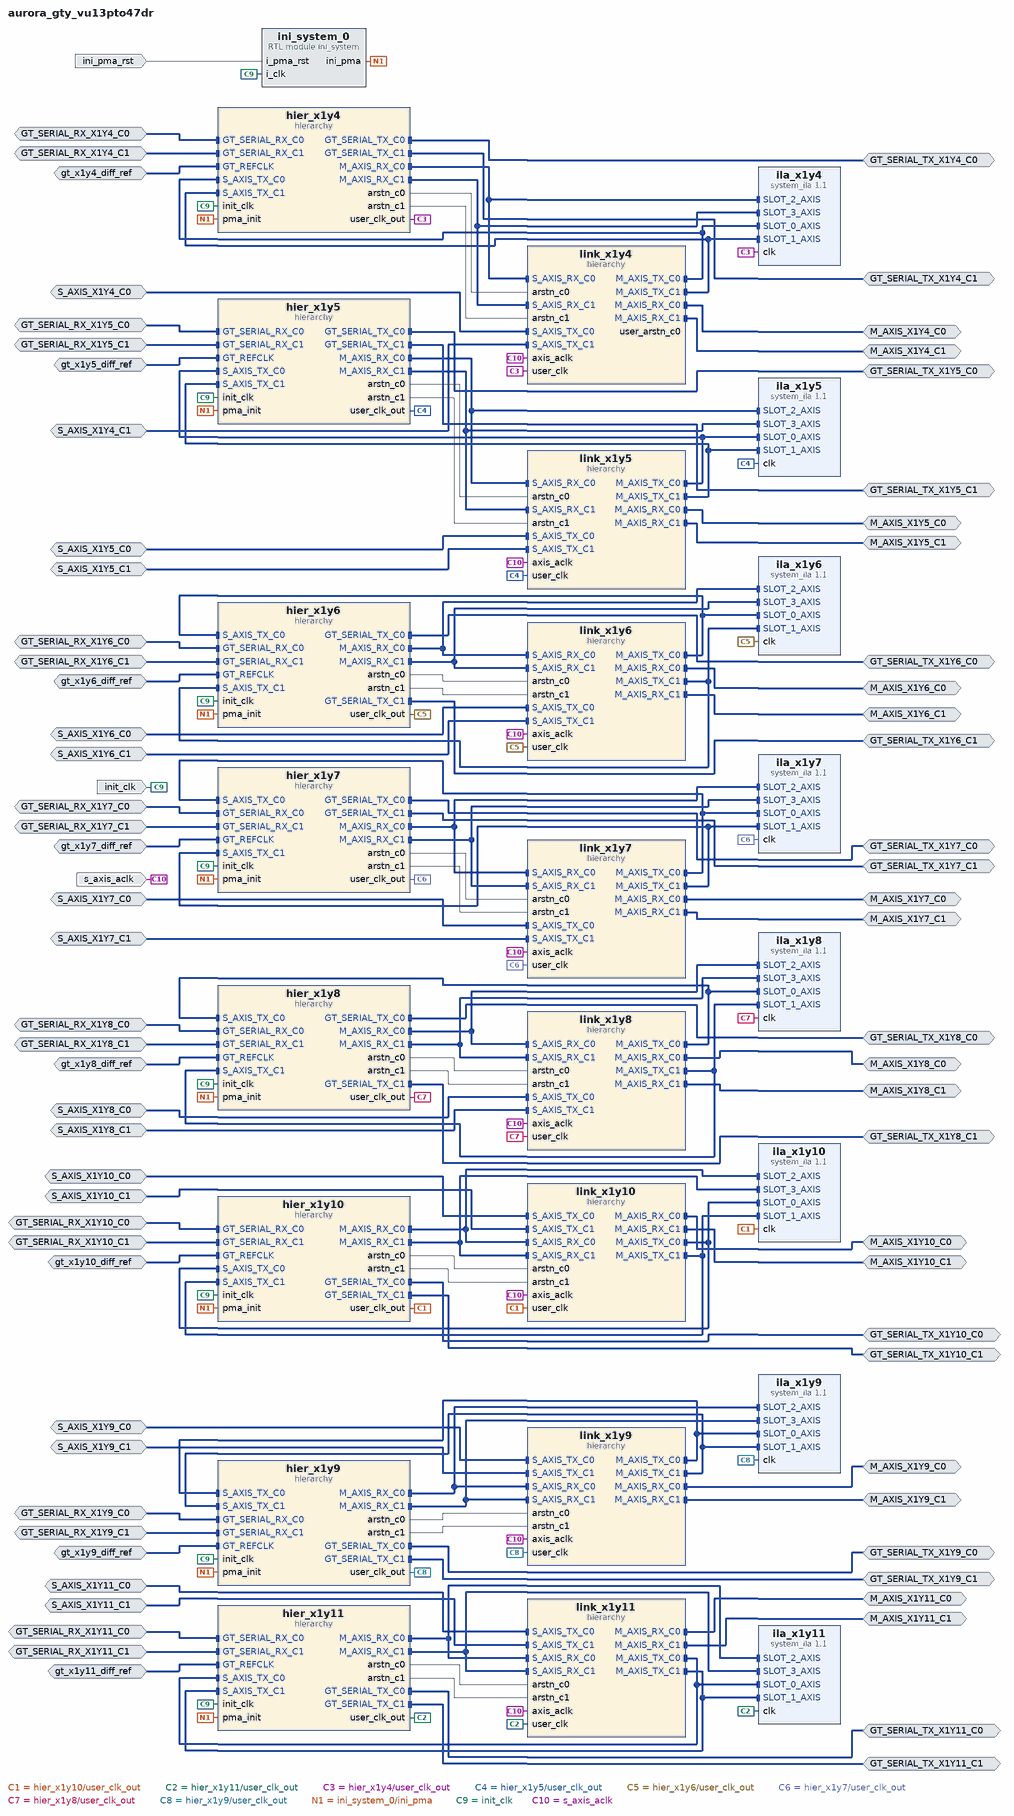
[diagram p0: block diagram of the top level]
# Vivado block design aurora_gty_vu13pto47dr, xcvu13p-fhgb2104-2-i, Vivado 2025.2
create_bd_design aurora_gty_vu13pto47dr

create_bd_intf_port -mode Slave -vlnv xilinx.com:display_aurora64b66b:GT_Serial_Transceiver_Pins_RX_rtl:1.0 GT_SERIAL_RX_X1Y8_C0
create_bd_intf_port -mode Slave -vlnv xilinx.com:display_aurora64b66b:GT_Serial_Transceiver_Pins_RX_rtl:1.0 GT_SERIAL_RX_X1Y4_C0
create_bd_intf_port -mode Slave -vlnv xilinx.com:display_aurora64b66b:GT_Serial_Transceiver_Pins_RX_rtl:1.0 GT_SERIAL_RX_X1Y4_C1
create_bd_intf_port -mode Master -vlnv xilinx.com:display_aurora64b66b:GT_Serial_Transceiver_Pins_TX_rtl:1.0 GT_SERIAL_TX_X1Y8_C0
create_bd_intf_port -mode Master -vlnv xilinx.com:display_aurora64b66b:GT_Serial_Transceiver_Pins_TX_rtl:1.0 GT_SERIAL_TX_X1Y4_C0
create_bd_intf_port -mode Master -vlnv xilinx.com:display_aurora64b66b:GT_Serial_Transceiver_Pins_TX_rtl:1.0 GT_SERIAL_TX_X1Y4_C1
create_bd_intf_port -mode Master -vlnv xilinx.com:interface:axis_rtl:1.0 M_AXIS_X1Y4_C0
set_property -dict {CONFIG.FREQ_HZ 256000000} [get_bd_intf_ports M_AXIS_X1Y4_C0]
create_bd_intf_port -mode Master -vlnv xilinx.com:interface:axis_rtl:1.0 M_AXIS_X1Y4_C1
set_property -dict {CONFIG.FREQ_HZ 256000000} [get_bd_intf_ports M_AXIS_X1Y4_C1]
create_bd_intf_port -mode Master -vlnv xilinx.com:interface:axis_rtl:1.0 M_AXIS_X1Y8_C0
set_property -dict {CONFIG.FREQ_HZ 256000000} [get_bd_intf_ports M_AXIS_X1Y8_C0]
create_bd_intf_port -mode Slave -vlnv xilinx.com:interface:axis_rtl:1.0 S_AXIS_X1Y4_C0
set_property -dict [list \
  CONFIG.FREQ_HZ 256000000 \
  CONFIG.HAS_TKEEP 0 \
  CONFIG.HAS_TLAST 1 \
  CONFIG.HAS_TREADY 1 \
  CONFIG.HAS_TSTRB 0 \
  CONFIG.LAYERED_METADATA undef \
  CONFIG.TDATA_NUM_BYTES 16 \
  CONFIG.TDEST_WIDTH 0 \
  CONFIG.TID_WIDTH 0 \
  CONFIG.TUSER_WIDTH 64 \
] [get_bd_intf_ports S_AXIS_X1Y4_C0]
create_bd_intf_port -mode Slave -vlnv xilinx.com:interface:axis_rtl:1.0 S_AXIS_X1Y4_C1
set_property -dict [list \
  CONFIG.FREQ_HZ 256000000 \
  CONFIG.HAS_TKEEP 0 \
  CONFIG.HAS_TLAST 1 \
  CONFIG.HAS_TREADY 1 \
  CONFIG.HAS_TSTRB 0 \
  CONFIG.LAYERED_METADATA undef \
  CONFIG.TDATA_NUM_BYTES 16 \
  CONFIG.TDEST_WIDTH 0 \
  CONFIG.TID_WIDTH 0 \
  CONFIG.TUSER_WIDTH 64 \
] [get_bd_intf_ports S_AXIS_X1Y4_C1]
create_bd_intf_port -mode Slave -vlnv xilinx.com:interface:diff_clock_rtl:1.0 gt_x1y4_diff_ref
set_property -dict {CONFIG.FREQ_HZ 156250000} [get_bd_intf_ports gt_x1y4_diff_ref]
create_bd_intf_port -mode Slave -vlnv xilinx.com:interface:diff_clock_rtl:1.0 gt_x1y8_diff_ref
set_property -dict {CONFIG.FREQ_HZ 156250000} [get_bd_intf_ports gt_x1y8_diff_ref]
create_bd_intf_port -mode Slave -vlnv xilinx.com:interface:diff_clock_rtl:1.0 gt_x1y5_diff_ref
set_property -dict {CONFIG.FREQ_HZ 156250000} [get_bd_intf_ports gt_x1y5_diff_ref]
create_bd_intf_port -mode Slave -vlnv xilinx.com:display_aurora64b66b:GT_Serial_Transceiver_Pins_RX_rtl:1.0 GT_SERIAL_RX_X1Y5_C0
create_bd_intf_port -mode Slave -vlnv xilinx.com:display_aurora64b66b:GT_Serial_Transceiver_Pins_RX_rtl:1.0 GT_SERIAL_RX_X1Y5_C1
create_bd_intf_port -mode Master -vlnv xilinx.com:display_aurora64b66b:GT_Serial_Transceiver_Pins_TX_rtl:1.0 GT_SERIAL_TX_X1Y5_C0
create_bd_intf_port -mode Master -vlnv xilinx.com:display_aurora64b66b:GT_Serial_Transceiver_Pins_TX_rtl:1.0 GT_SERIAL_TX_X1Y5_C1
create_bd_intf_port -mode Slave -vlnv xilinx.com:interface:axis_rtl:1.0 S_AXIS_X1Y5_C0
set_property -dict [list \
  CONFIG.FREQ_HZ 256000000 \
  CONFIG.HAS_TKEEP 0 \
  CONFIG.HAS_TLAST 1 \
  CONFIG.HAS_TREADY 1 \
  CONFIG.HAS_TSTRB 0 \
  CONFIG.LAYERED_METADATA undef \
  CONFIG.TDATA_NUM_BYTES 16 \
  CONFIG.TDEST_WIDTH 0 \
  CONFIG.TID_WIDTH 0 \
  CONFIG.TUSER_WIDTH 64 \
] [get_bd_intf_ports S_AXIS_X1Y5_C0]
create_bd_intf_port -mode Slave -vlnv xilinx.com:interface:axis_rtl:1.0 S_AXIS_X1Y5_C1
set_property -dict [list \
  CONFIG.FREQ_HZ 256000000 \
  CONFIG.HAS_TKEEP 0 \
  CONFIG.HAS_TLAST 1 \
  CONFIG.HAS_TREADY 1 \
  CONFIG.HAS_TSTRB 0 \
  CONFIG.LAYERED_METADATA undef \
  CONFIG.TDATA_NUM_BYTES 16 \
  CONFIG.TDEST_WIDTH 0 \
  CONFIG.TID_WIDTH 0 \
  CONFIG.TUSER_WIDTH 64 \
] [get_bd_intf_ports S_AXIS_X1Y5_C1]
create_bd_intf_port -mode Slave -vlnv xilinx.com:interface:diff_clock_rtl:1.0 gt_x1y6_diff_ref
set_property -dict {CONFIG.FREQ_HZ 156250000} [get_bd_intf_ports gt_x1y6_diff_ref]
create_bd_intf_port -mode Slave -vlnv xilinx.com:display_aurora64b66b:GT_Serial_Transceiver_Pins_RX_rtl:1.0 GT_SERIAL_RX_X1Y6_C0
create_bd_intf_port -mode Slave -vlnv xilinx.com:display_aurora64b66b:GT_Serial_Transceiver_Pins_RX_rtl:1.0 GT_SERIAL_RX_X1Y6_C1
create_bd_intf_port -mode Master -vlnv xilinx.com:display_aurora64b66b:GT_Serial_Transceiver_Pins_TX_rtl:1.0 GT_SERIAL_TX_X1Y6_C0
create_bd_intf_port -mode Master -vlnv xilinx.com:display_aurora64b66b:GT_Serial_Transceiver_Pins_TX_rtl:1.0 GT_SERIAL_TX_X1Y6_C1
create_bd_intf_port -mode Slave -vlnv xilinx.com:interface:axis_rtl:1.0 S_AXIS_X1Y6_C0
set_property -dict [list \
  CONFIG.FREQ_HZ 256000000 \
  CONFIG.HAS_TKEEP 0 \
  CONFIG.HAS_TLAST 1 \
  CONFIG.HAS_TREADY 1 \
  CONFIG.HAS_TSTRB 0 \
  CONFIG.LAYERED_METADATA undef \
  CONFIG.TDATA_NUM_BYTES 16 \
  CONFIG.TDEST_WIDTH 0 \
  CONFIG.TID_WIDTH 0 \
  CONFIG.TUSER_WIDTH 64 \
] [get_bd_intf_ports S_AXIS_X1Y6_C0]
create_bd_intf_port -mode Slave -vlnv xilinx.com:interface:axis_rtl:1.0 S_AXIS_X1Y6_C1
set_property -dict [list \
  CONFIG.FREQ_HZ 256000000 \
  CONFIG.HAS_TKEEP 0 \
  CONFIG.HAS_TLAST 1 \
  CONFIG.HAS_TREADY 1 \
  CONFIG.HAS_TSTRB 0 \
  CONFIG.LAYERED_METADATA undef \
  CONFIG.TDATA_NUM_BYTES 16 \
  CONFIG.TDEST_WIDTH 0 \
  CONFIG.TID_WIDTH 0 \
  CONFIG.TUSER_WIDTH 64 \
] [get_bd_intf_ports S_AXIS_X1Y6_C1]
create_bd_intf_port -mode Slave -vlnv xilinx.com:interface:diff_clock_rtl:1.0 gt_x1y7_diff_ref
set_property -dict {CONFIG.FREQ_HZ 156250000} [get_bd_intf_ports gt_x1y7_diff_ref]
create_bd_intf_port -mode Slave -vlnv xilinx.com:display_aurora64b66b:GT_Serial_Transceiver_Pins_RX_rtl:1.0 GT_SERIAL_RX_X1Y7_C0
create_bd_intf_port -mode Slave -vlnv xilinx.com:display_aurora64b66b:GT_Serial_Transceiver_Pins_RX_rtl:1.0 GT_SERIAL_RX_X1Y7_C1
create_bd_intf_port -mode Master -vlnv xilinx.com:display_aurora64b66b:GT_Serial_Transceiver_Pins_TX_rtl:1.0 GT_SERIAL_TX_X1Y7_C0
create_bd_intf_port -mode Master -vlnv xilinx.com:display_aurora64b66b:GT_Serial_Transceiver_Pins_TX_rtl:1.0 GT_SERIAL_TX_X1Y7_C1
create_bd_intf_port -mode Slave -vlnv xilinx.com:interface:axis_rtl:1.0 S_AXIS_X1Y7_C0
set_property -dict [list \
  CONFIG.FREQ_HZ 256000000 \
  CONFIG.HAS_TKEEP 0 \
  CONFIG.HAS_TLAST 1 \
  CONFIG.HAS_TREADY 1 \
  CONFIG.HAS_TSTRB 0 \
  CONFIG.LAYERED_METADATA undef \
  CONFIG.TDATA_NUM_BYTES 16 \
  CONFIG.TDEST_WIDTH 0 \
  CONFIG.TID_WIDTH 0 \
  CONFIG.TUSER_WIDTH 64 \
] [get_bd_intf_ports S_AXIS_X1Y7_C0]
create_bd_intf_port -mode Slave -vlnv xilinx.com:interface:axis_rtl:1.0 S_AXIS_X1Y7_C1
set_property -dict [list \
  CONFIG.FREQ_HZ 256000000 \
  CONFIG.HAS_TKEEP 0 \
  CONFIG.HAS_TLAST 1 \
  CONFIG.HAS_TREADY 1 \
  CONFIG.HAS_TSTRB 0 \
  CONFIG.LAYERED_METADATA undef \
  CONFIG.TDATA_NUM_BYTES 16 \
  CONFIG.TDEST_WIDTH 0 \
  CONFIG.TID_WIDTH 0 \
  CONFIG.TUSER_WIDTH 64 \
] [get_bd_intf_ports S_AXIS_X1Y7_C1]
create_bd_intf_port -mode Slave -vlnv xilinx.com:display_aurora64b66b:GT_Serial_Transceiver_Pins_RX_rtl:1.0 GT_SERIAL_RX_X1Y8_C1
create_bd_intf_port -mode Master -vlnv xilinx.com:display_aurora64b66b:GT_Serial_Transceiver_Pins_TX_rtl:1.0 GT_SERIAL_TX_X1Y8_C1
create_bd_intf_port -mode Slave -vlnv xilinx.com:interface:diff_clock_rtl:1.0 gt_x1y9_diff_ref
set_property -dict {CONFIG.FREQ_HZ 156250000} [get_bd_intf_ports gt_x1y9_diff_ref]
create_bd_intf_port -mode Slave -vlnv xilinx.com:display_aurora64b66b:GT_Serial_Transceiver_Pins_RX_rtl:1.0 GT_SERIAL_RX_X1Y9_C0
create_bd_intf_port -mode Slave -vlnv xilinx.com:display_aurora64b66b:GT_Serial_Transceiver_Pins_RX_rtl:1.0 GT_SERIAL_RX_X1Y9_C1
create_bd_intf_port -mode Master -vlnv xilinx.com:display_aurora64b66b:GT_Serial_Transceiver_Pins_TX_rtl:1.0 GT_SERIAL_TX_X1Y9_C0
create_bd_intf_port -mode Master -vlnv xilinx.com:display_aurora64b66b:GT_Serial_Transceiver_Pins_TX_rtl:1.0 GT_SERIAL_TX_X1Y9_C1
create_bd_intf_port -mode Slave -vlnv xilinx.com:interface:diff_clock_rtl:1.0 gt_x1y10_diff_ref
set_property -dict {CONFIG.FREQ_HZ 156250000} [get_bd_intf_ports gt_x1y10_diff_ref]
create_bd_intf_port -mode Slave -vlnv xilinx.com:display_aurora64b66b:GT_Serial_Transceiver_Pins_RX_rtl:1.0 GT_SERIAL_RX_X1Y10_C0
create_bd_intf_port -mode Slave -vlnv xilinx.com:display_aurora64b66b:GT_Serial_Transceiver_Pins_RX_rtl:1.0 GT_SERIAL_RX_X1Y10_C1
create_bd_intf_port -mode Master -vlnv xilinx.com:display_aurora64b66b:GT_Serial_Transceiver_Pins_TX_rtl:1.0 GT_SERIAL_TX_X1Y10_C0
create_bd_intf_port -mode Master -vlnv xilinx.com:display_aurora64b66b:GT_Serial_Transceiver_Pins_TX_rtl:1.0 GT_SERIAL_TX_X1Y10_C1
create_bd_intf_port -mode Slave -vlnv xilinx.com:interface:diff_clock_rtl:1.0 gt_x1y11_diff_ref
set_property -dict {CONFIG.FREQ_HZ 156250000} [get_bd_intf_ports gt_x1y11_diff_ref]
create_bd_intf_port -mode Slave -vlnv xilinx.com:display_aurora64b66b:GT_Serial_Transceiver_Pins_RX_rtl:1.0 GT_SERIAL_RX_X1Y11_C0
create_bd_intf_port -mode Slave -vlnv xilinx.com:display_aurora64b66b:GT_Serial_Transceiver_Pins_RX_rtl:1.0 GT_SERIAL_RX_X1Y11_C1
create_bd_intf_port -mode Master -vlnv xilinx.com:display_aurora64b66b:GT_Serial_Transceiver_Pins_TX_rtl:1.0 GT_SERIAL_TX_X1Y11_C0
create_bd_intf_port -mode Master -vlnv xilinx.com:display_aurora64b66b:GT_Serial_Transceiver_Pins_TX_rtl:1.0 GT_SERIAL_TX_X1Y11_C1
create_bd_intf_port -mode Master -vlnv xilinx.com:interface:axis_rtl:1.0 M_AXIS_X1Y5_C0
set_property -dict {CONFIG.FREQ_HZ 256000000} [get_bd_intf_ports M_AXIS_X1Y5_C0]
create_bd_intf_port -mode Master -vlnv xilinx.com:interface:axis_rtl:1.0 M_AXIS_X1Y5_C1
set_property -dict {CONFIG.FREQ_HZ 256000000} [get_bd_intf_ports M_AXIS_X1Y5_C1]
create_bd_intf_port -mode Master -vlnv xilinx.com:interface:axis_rtl:1.0 M_AXIS_X1Y6_C0
set_property -dict {CONFIG.FREQ_HZ 256000000} [get_bd_intf_ports M_AXIS_X1Y6_C0]
create_bd_intf_port -mode Master -vlnv xilinx.com:interface:axis_rtl:1.0 M_AXIS_X1Y6_C1
set_property -dict {CONFIG.FREQ_HZ 256000000} [get_bd_intf_ports M_AXIS_X1Y6_C1]
create_bd_intf_port -mode Master -vlnv xilinx.com:interface:axis_rtl:1.0 M_AXIS_X1Y7_C0
set_property -dict {CONFIG.FREQ_HZ 256000000} [get_bd_intf_ports M_AXIS_X1Y7_C0]
create_bd_intf_port -mode Master -vlnv xilinx.com:interface:axis_rtl:1.0 M_AXIS_X1Y7_C1
set_property -dict {CONFIG.FREQ_HZ 256000000} [get_bd_intf_ports M_AXIS_X1Y7_C1]
create_bd_intf_port -mode Master -vlnv xilinx.com:interface:axis_rtl:1.0 M_AXIS_X1Y8_C1
set_property -dict {CONFIG.FREQ_HZ 256000000} [get_bd_intf_ports M_AXIS_X1Y8_C1]
create_bd_intf_port -mode Slave -vlnv xilinx.com:interface:axis_rtl:1.0 S_AXIS_X1Y8_C0
set_property -dict [list \
  CONFIG.FREQ_HZ 256000000 \
  CONFIG.HAS_TKEEP 0 \
  CONFIG.HAS_TLAST 1 \
  CONFIG.HAS_TREADY 1 \
  CONFIG.HAS_TSTRB 0 \
  CONFIG.LAYERED_METADATA undef \
  CONFIG.TDATA_NUM_BYTES 16 \
  CONFIG.TDEST_WIDTH 0 \
  CONFIG.TID_WIDTH 0 \
  CONFIG.TUSER_WIDTH 64 \
] [get_bd_intf_ports S_AXIS_X1Y8_C0]
create_bd_intf_port -mode Slave -vlnv xilinx.com:interface:axis_rtl:1.0 S_AXIS_X1Y8_C1
set_property -dict [list \
  CONFIG.FREQ_HZ 256000000 \
  CONFIG.HAS_TKEEP 0 \
  CONFIG.HAS_TLAST 1 \
  CONFIG.HAS_TREADY 1 \
  CONFIG.HAS_TSTRB 0 \
  CONFIG.LAYERED_METADATA undef \
  CONFIG.TDATA_NUM_BYTES 16 \
  CONFIG.TDEST_WIDTH 0 \
  CONFIG.TID_WIDTH 0 \
  CONFIG.TUSER_WIDTH 64 \
] [get_bd_intf_ports S_AXIS_X1Y8_C1]
create_bd_intf_port -mode Master -vlnv xilinx.com:interface:axis_rtl:1.0 M_AXIS_X1Y9_C0
set_property -dict {CONFIG.FREQ_HZ 256000000} [get_bd_intf_ports M_AXIS_X1Y9_C0]
create_bd_intf_port -mode Master -vlnv xilinx.com:interface:axis_rtl:1.0 M_AXIS_X1Y9_C1
set_property -dict {CONFIG.FREQ_HZ 256000000} [get_bd_intf_ports M_AXIS_X1Y9_C1]
create_bd_intf_port -mode Slave -vlnv xilinx.com:interface:axis_rtl:1.0 S_AXIS_X1Y9_C0
set_property -dict [list \
  CONFIG.FREQ_HZ 256000000 \
  CONFIG.HAS_TKEEP 0 \
  CONFIG.HAS_TLAST 1 \
  CONFIG.HAS_TREADY 1 \
  CONFIG.HAS_TSTRB 0 \
  CONFIG.LAYERED_METADATA undef \
  CONFIG.TDATA_NUM_BYTES 16 \
  CONFIG.TDEST_WIDTH 0 \
  CONFIG.TID_WIDTH 0 \
  CONFIG.TUSER_WIDTH 64 \
] [get_bd_intf_ports S_AXIS_X1Y9_C0]
create_bd_intf_port -mode Slave -vlnv xilinx.com:interface:axis_rtl:1.0 S_AXIS_X1Y9_C1
set_property -dict [list \
  CONFIG.FREQ_HZ 256000000 \
  CONFIG.HAS_TKEEP 0 \
  CONFIG.HAS_TLAST 1 \
  CONFIG.HAS_TREADY 1 \
  CONFIG.HAS_TSTRB 0 \
  CONFIG.LAYERED_METADATA undef \
  CONFIG.TDATA_NUM_BYTES 16 \
  CONFIG.TDEST_WIDTH 0 \
  CONFIG.TID_WIDTH 0 \
  CONFIG.TUSER_WIDTH 64 \
] [get_bd_intf_ports S_AXIS_X1Y9_C1]
create_bd_intf_port -mode Master -vlnv xilinx.com:interface:axis_rtl:1.0 M_AXIS_X1Y10_C0
set_property -dict {CONFIG.FREQ_HZ 256000000} [get_bd_intf_ports M_AXIS_X1Y10_C0]
create_bd_intf_port -mode Master -vlnv xilinx.com:interface:axis_rtl:1.0 M_AXIS_X1Y10_C1
set_property -dict {CONFIG.FREQ_HZ 256000000} [get_bd_intf_ports M_AXIS_X1Y10_C1]
create_bd_intf_port -mode Slave -vlnv xilinx.com:interface:axis_rtl:1.0 S_AXIS_X1Y10_C0
set_property -dict [list \
  CONFIG.FREQ_HZ 256000000 \
  CONFIG.HAS_TKEEP 0 \
  CONFIG.HAS_TLAST 1 \
  CONFIG.HAS_TREADY 1 \
  CONFIG.HAS_TSTRB 0 \
  CONFIG.LAYERED_METADATA undef \
  CONFIG.TDATA_NUM_BYTES 16 \
  CONFIG.TDEST_WIDTH 0 \
  CONFIG.TID_WIDTH 0 \
  CONFIG.TUSER_WIDTH 64 \
] [get_bd_intf_ports S_AXIS_X1Y10_C0]
create_bd_intf_port -mode Slave -vlnv xilinx.com:interface:axis_rtl:1.0 S_AXIS_X1Y10_C1
set_property -dict [list \
  CONFIG.FREQ_HZ 256000000 \
  CONFIG.HAS_TKEEP 0 \
  CONFIG.HAS_TLAST 1 \
  CONFIG.HAS_TREADY 1 \
  CONFIG.HAS_TSTRB 0 \
  CONFIG.LAYERED_METADATA undef \
  CONFIG.TDATA_NUM_BYTES 16 \
  CONFIG.TDEST_WIDTH 0 \
  CONFIG.TID_WIDTH 0 \
  CONFIG.TUSER_WIDTH 64 \
] [get_bd_intf_ports S_AXIS_X1Y10_C1]
create_bd_intf_port -mode Master -vlnv xilinx.com:interface:axis_rtl:1.0 M_AXIS_X1Y11_C0
set_property -dict {CONFIG.FREQ_HZ 256000000} [get_bd_intf_ports M_AXIS_X1Y11_C0]
create_bd_intf_port -mode Master -vlnv xilinx.com:interface:axis_rtl:1.0 M_AXIS_X1Y11_C1
set_property -dict {CONFIG.FREQ_HZ 256000000} [get_bd_intf_ports M_AXIS_X1Y11_C1]
create_bd_intf_port -mode Slave -vlnv xilinx.com:interface:axis_rtl:1.0 S_AXIS_X1Y11_C0
set_property -dict [list \
  CONFIG.FREQ_HZ 256000000 \
  CONFIG.HAS_TKEEP 0 \
  CONFIG.HAS_TLAST 1 \
  CONFIG.HAS_TREADY 1 \
  CONFIG.HAS_TSTRB 0 \
  CONFIG.LAYERED_METADATA undef \
  CONFIG.TDATA_NUM_BYTES 16 \
  CONFIG.TDEST_WIDTH 0 \
  CONFIG.TID_WIDTH 0 \
  CONFIG.TUSER_WIDTH 64 \
] [get_bd_intf_ports S_AXIS_X1Y11_C0]
create_bd_intf_port -mode Slave -vlnv xilinx.com:interface:axis_rtl:1.0 S_AXIS_X1Y11_C1
set_property -dict [list \
  CONFIG.FREQ_HZ 256000000 \
  CONFIG.HAS_TKEEP 0 \
  CONFIG.HAS_TLAST 1 \
  CONFIG.HAS_TREADY 1 \
  CONFIG.HAS_TSTRB 0 \
  CONFIG.LAYERED_METADATA undef \
  CONFIG.TDATA_NUM_BYTES 16 \
  CONFIG.TDEST_WIDTH 0 \
  CONFIG.TID_WIDTH 0 \
  CONFIG.TUSER_WIDTH 64 \
] [get_bd_intf_ports S_AXIS_X1Y11_C1]
create_bd_port -dir I -type rst ini_pma_rst
set_property -dict {CONFIG.POLARITY ACTIVE_HIGH} [get_bd_ports ini_pma_rst]
create_bd_port -dir I -type clk init_clk
set_property -dict {CONFIG.ASSOCIATED_RESET ini_pma_rst CONFIG.FREQ_HZ 100000000} [get_bd_ports init_clk]
create_bd_port -dir I -type clk s_axis_aclk
set_property -dict [list \
  CONFIG.ASSOCIATED_BUSIF M_AXIS_X1Y4_C0:M_AXIS_X1Y4_C0_1:M_AXIS_X1Y8_C0:S_AXIS_X1Y4_C0:S_AXIS_X1Y4_C0_1:S_AXIS_X1Y5_C0:S_AXIS_X1Y5_C0_1:S_AXIS_X1Y6_C0:S_AXIS_X1Y6_C0_1:S_AXIS_X1Y7_C0:S_AXIS_X1Y7_C0_1:M_AXIS_X1Y5_C0:M_AXIS_X1Y5_C0_1:M_AXIS_X1Y6_C0:M_AXIS_X1Y6_C0_1:M_AXIS_X1Y7_C0:M_AXIS_X1Y7_C0_1:M_AXIS_X1Y8_C0_1:S_AXIS_X1Y8_C0:S_AXIS_X1Y8_C0_1:M_AXIS_X1Y9_C0:M_AXIS_X1Y9_C0_1:S_AXIS_X1Y9_C0:S_AXIS_X1Y9_C0_1:M_AXIS_X1Y10_C0:M_AXIS_X1Y10_C0_1:S_AXIS_X1Y10_C0:S_AXIS_X1Y10_C0_1:M_AXIS_X1Y11_C0:M_AXIS_X1Y11_C0_1:S_AXIS_X1Y11_C0:S_AXIS_X1Y11_C0_1:M_AXIS_X1Y4_C1:S_AXIS_X1Y4_C1:S_AXIS_X1Y5_C1:S_AXIS_X1Y6_C1:S_AXIS_X1Y7_C1:M_AXIS_X1Y5_C1:M_AXIS_X1Y6_C1:M_AXIS_X1Y7_C1:M_AXIS_X1Y8_C1:S_AXIS_X1Y8_C1:M_AXIS_X1Y9_C1:S_AXIS_X1Y9_C1:M_AXIS_X1Y10_C1:S_AXIS_X1Y10_C1:M_AXIS_X1Y11_C1:S_AXIS_X1Y11_C1 \
  CONFIG.FREQ_HZ 256000000 \
] [get_bd_ports s_axis_aclk]

create_bd_cell -type module -reference ini_system ini_system_0
create_bd_cell -type hier hier_x1y4
create_bd_cell -type hier hier_x1y8
create_bd_cell -type hier hier_x1y9
create_bd_cell -type hier hier_x1y10
create_bd_cell -type hier hier_x1y11
create_bd_cell -type hier hier_x1y5
create_bd_cell -type hier hier_x1y6
create_bd_cell -type hier hier_x1y7
create_bd_cell -type hier link_x1y4
create_bd_cell -type hier link_x1y5
create_bd_cell -type hier link_x1y6
create_bd_cell -type hier link_x1y7
create_bd_cell -type hier link_x1y8
create_bd_cell -type hier link_x1y9
create_bd_cell -type hier link_x1y10
create_bd_cell -type hier link_x1y11
create_bd_cell -type ip -vlnv xilinx.com:ip:system_ila:1.1 ila_x1y4
set_property -dict [list \
  CONFIG.C_DATA_DEPTH 2048 \
  CONFIG.C_MON_TYPE INTERFACE \
  CONFIG.C_NUM_MONITOR_SLOTS 4 \
  CONFIG.C_SLOT_0_INTF_TYPE xilinx.com:interface:axis_rtl:1.0 \
  CONFIG.C_SLOT_1_INTF_TYPE xilinx.com:interface:axis_rtl:1.0 \
  CONFIG.C_SLOT_2_INTF_TYPE xilinx.com:interface:axis_rtl:1.0 \
  CONFIG.C_SLOT_3_INTF_TYPE xilinx.com:interface:axis_rtl:1.0 \
] [get_bd_cells ila_x1y4]
create_bd_cell -type ip -vlnv xilinx.com:ip:system_ila:1.1 ila_x1y5
set_property -dict [list \
  CONFIG.C_DATA_DEPTH 2048 \
  CONFIG.C_MON_TYPE INTERFACE \
  CONFIG.C_NUM_MONITOR_SLOTS 4 \
  CONFIG.C_SLOT_0_INTF_TYPE xilinx.com:interface:axis_rtl:1.0 \
  CONFIG.C_SLOT_1_INTF_TYPE xilinx.com:interface:axis_rtl:1.0 \
  CONFIG.C_SLOT_2_INTF_TYPE xilinx.com:interface:axis_rtl:1.0 \
  CONFIG.C_SLOT_3_INTF_TYPE xilinx.com:interface:axis_rtl:1.0 \
] [get_bd_cells ila_x1y5]
create_bd_cell -type ip -vlnv xilinx.com:ip:system_ila:1.1 ila_x1y6
set_property -dict [list \
  CONFIG.C_DATA_DEPTH 2048 \
  CONFIG.C_MON_TYPE INTERFACE \
  CONFIG.C_NUM_MONITOR_SLOTS 4 \
  CONFIG.C_SLOT_0_INTF_TYPE xilinx.com:interface:axis_rtl:1.0 \
  CONFIG.C_SLOT_1_INTF_TYPE xilinx.com:interface:axis_rtl:1.0 \
  CONFIG.C_SLOT_2_INTF_TYPE xilinx.com:interface:axis_rtl:1.0 \
  CONFIG.C_SLOT_3_INTF_TYPE xilinx.com:interface:axis_rtl:1.0 \
] [get_bd_cells ila_x1y6]
create_bd_cell -type ip -vlnv xilinx.com:ip:system_ila:1.1 ila_x1y7
set_property -dict [list \
  CONFIG.C_DATA_DEPTH 2048 \
  CONFIG.C_MON_TYPE INTERFACE \
  CONFIG.C_NUM_MONITOR_SLOTS 4 \
  CONFIG.C_SLOT_0_INTF_TYPE xilinx.com:interface:axis_rtl:1.0 \
  CONFIG.C_SLOT_1_INTF_TYPE xilinx.com:interface:axis_rtl:1.0 \
  CONFIG.C_SLOT_2_INTF_TYPE xilinx.com:interface:axis_rtl:1.0 \
  CONFIG.C_SLOT_3_INTF_TYPE xilinx.com:interface:axis_rtl:1.0 \
] [get_bd_cells ila_x1y7]
create_bd_cell -type ip -vlnv xilinx.com:ip:system_ila:1.1 ila_x1y8
set_property -dict [list \
  CONFIG.C_DATA_DEPTH 2048 \
  CONFIG.C_MON_TYPE INTERFACE \
  CONFIG.C_NUM_MONITOR_SLOTS 4 \
  CONFIG.C_SLOT_0_INTF_TYPE xilinx.com:interface:axis_rtl:1.0 \
  CONFIG.C_SLOT_1_INTF_TYPE xilinx.com:interface:axis_rtl:1.0 \
  CONFIG.C_SLOT_2_INTF_TYPE xilinx.com:interface:axis_rtl:1.0 \
  CONFIG.C_SLOT_3_INTF_TYPE xilinx.com:interface:axis_rtl:1.0 \
] [get_bd_cells ila_x1y8]
create_bd_cell -type ip -vlnv xilinx.com:ip:system_ila:1.1 ila_x1y9
set_property -dict [list \
  CONFIG.C_DATA_DEPTH 2048 \
  CONFIG.C_MON_TYPE INTERFACE \
  CONFIG.C_NUM_MONITOR_SLOTS 4 \
  CONFIG.C_SLOT_0_INTF_TYPE xilinx.com:interface:axis_rtl:1.0 \
  CONFIG.C_SLOT_1_INTF_TYPE xilinx.com:interface:axis_rtl:1.0 \
  CONFIG.C_SLOT_2_INTF_TYPE xilinx.com:interface:axis_rtl:1.0 \
  CONFIG.C_SLOT_3_INTF_TYPE xilinx.com:interface:axis_rtl:1.0 \
] [get_bd_cells ila_x1y9]
create_bd_cell -type ip -vlnv xilinx.com:ip:system_ila:1.1 ila_x1y10
set_property -dict [list \
  CONFIG.C_DATA_DEPTH 2048 \
  CONFIG.C_MON_TYPE INTERFACE \
  CONFIG.C_NUM_MONITOR_SLOTS 4 \
  CONFIG.C_SLOT_0_INTF_TYPE xilinx.com:interface:axis_rtl:1.0 \
  CONFIG.C_SLOT_1_INTF_TYPE xilinx.com:interface:axis_rtl:1.0 \
  CONFIG.C_SLOT_2_INTF_TYPE xilinx.com:interface:axis_rtl:1.0 \
  CONFIG.C_SLOT_3_INTF_TYPE xilinx.com:interface:axis_rtl:1.0 \
] [get_bd_cells ila_x1y10]
create_bd_cell -type ip -vlnv xilinx.com:ip:system_ila:1.1 ila_x1y11
set_property -dict [list \
  CONFIG.C_DATA_DEPTH 2048 \
  CONFIG.C_MON_TYPE INTERFACE \
  CONFIG.C_NUM_MONITOR_SLOTS 4 \
  CONFIG.C_SLOT_0_INTF_TYPE xilinx.com:interface:axis_rtl:1.0 \
  CONFIG.C_SLOT_1_INTF_TYPE xilinx.com:interface:axis_rtl:1.0 \
  CONFIG.C_SLOT_2_INTF_TYPE xilinx.com:interface:axis_rtl:1.0 \
  CONFIG.C_SLOT_3_INTF_TYPE xilinx.com:interface:axis_rtl:1.0 \
] [get_bd_cells ila_x1y11]

# ---- hierarchy /hier_x1y4 ----
current_bd_instance /hier_x1y4
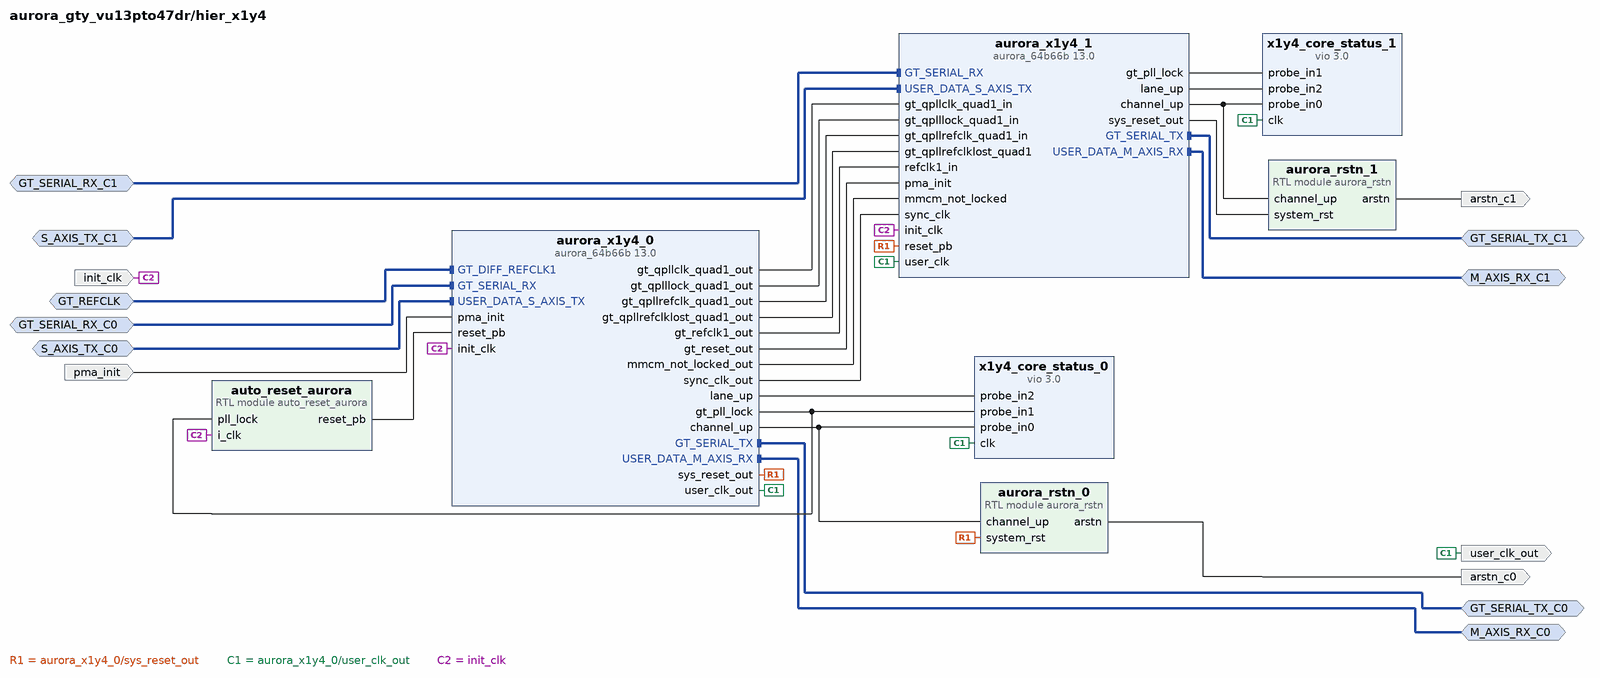
[diagram p1: block diagram inside /hier_x1y4]
create_bd_intf_pin -mode Slave -vlnv xilinx.com:interface:diff_clock_rtl:1.0 GT_REFCLK
create_bd_intf_pin -mode Master -vlnv xilinx.com:interface:axis_rtl:1.0 M_AXIS_RX_C0
create_bd_intf_pin -mode Slave -vlnv xilinx.com:interface:axis_rtl:1.0 S_AXIS_TX_C0
create_bd_intf_pin -mode Master -vlnv xilinx.com:interface:axis_rtl:1.0 M_AXIS_RX_C1
create_bd_intf_pin -mode Slave -vlnv xilinx.com:display_aurora64b66b:GT_Serial_Transceiver_Pins_RX_rtl:1.0 GT_SERIAL_RX_C1
create_bd_intf_pin -mode Master -vlnv xilinx.com:display_aurora64b66b:GT_Serial_Transceiver_Pins_TX_rtl:1.0 GT_SERIAL_TX_C1
create_bd_intf_pin -mode Master -vlnv xilinx.com:display_aurora64b66b:GT_Serial_Transceiver_Pins_TX_rtl:1.0 GT_SERIAL_TX_C0
create_bd_intf_pin -mode Slave -vlnv xilinx.com:display_aurora64b66b:GT_Serial_Transceiver_Pins_RX_rtl:1.0 GT_SERIAL_RX_C0
create_bd_intf_pin -mode Slave -vlnv xilinx.com:interface:axis_rtl:1.0 S_AXIS_TX_C1
create_bd_pin -dir O arstn_c1
create_bd_pin -dir O arstn_c0
create_bd_pin -dir I -type rst pma_init
create_bd_pin -dir O -type clk user_clk_out
create_bd_pin -dir I -type clk init_clk

create_bd_cell -type ip -vlnv xilinx.com:ip:aurora_64b66b:13.0 aurora_x1y4_0
set_property -dict [list \
  CONFIG.C_AURORA_LANES 2 \
  CONFIG.C_LINE_RATE 25.625 \
  CONFIG.C_REFCLK_SOURCE MGTREFCLK0_of_Quad_X1Y4 \
  CONFIG.C_START_QUAD Quad_X1Y4 \
  CONFIG.C_UCOLUMN_USED right \
  CONFIG.SupportLevel 1 \
  CONFIG.drp_mode Disabled \
  CONFIG.interface_mode Framing \
] [get_bd_cells aurora_x1y4_0]
create_bd_cell -type ip -vlnv xilinx.com:ip:vio:3.0 x1y4_core_status_1
set_property -dict {CONFIG.C_NUM_PROBE_IN 3 CONFIG.C_NUM_PROBE_OUT 0 CONFIG.C_PROBE_IN2_WIDTH 2} [get_bd_cells x1y4_core_status_1]
create_bd_cell -type ip -vlnv xilinx.com:ip:aurora_64b66b:13.0 aurora_x1y4_1
set_property -dict [list \
  CONFIG.C_AURORA_LANES 2 \
  CONFIG.C_LINE_RATE 25.625 \
  CONFIG.C_START_LANE X1Y18 \
  CONFIG.C_START_QUAD Quad_X1Y4 \
  CONFIG.C_UCOLUMN_USED right \
  CONFIG.SupportLevel 0 \
  CONFIG.drp_mode Disabled \
  CONFIG.interface_mode Framing \
] [get_bd_cells aurora_x1y4_1]
create_bd_cell -type ip -vlnv xilinx.com:ip:vio:3.0 x1y4_core_status_0
set_property -dict [list \
  CONFIG.C_NUM_PROBE_IN 3 \
  CONFIG.C_NUM_PROBE_OUT 0 \
  CONFIG.C_PROBE_IN2_WIDTH 2 \
  CONFIG.C_PROBE_IN5_WIDTH 2 \
] [get_bd_cells x1y4_core_status_0]
create_bd_cell -type module -reference auto_reset_aurora auto_reset_aurora
create_bd_cell -type module -reference aurora_rstn aurora_rstn_0
create_bd_cell -type module -reference aurora_rstn aurora_rstn_1

# ---- hierarchy /hier_x1y8 ----
current_bd_instance /hier_x1y8
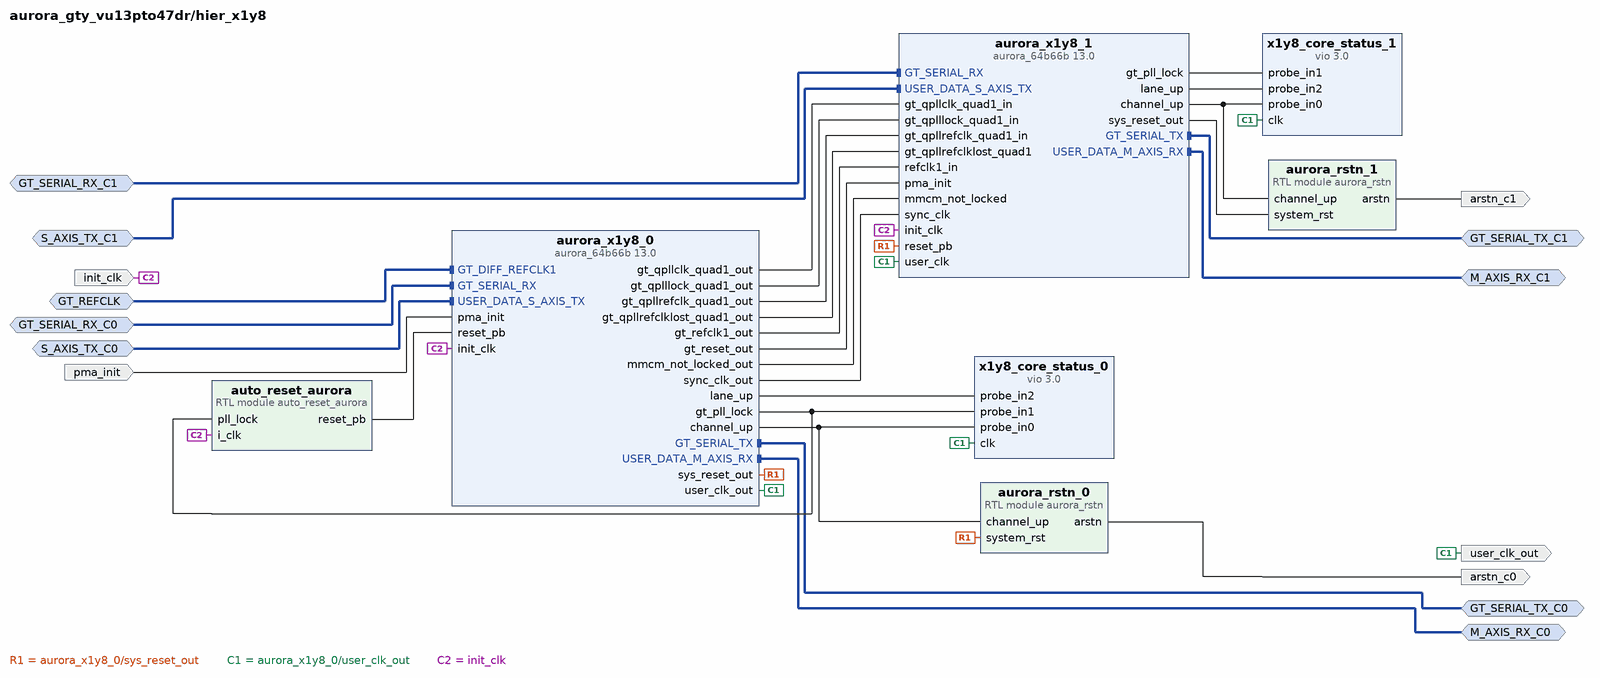
[diagram p2: block diagram inside /hier_x1y8]
create_bd_intf_pin -mode Slave -vlnv xilinx.com:interface:diff_clock_rtl:1.0 GT_REFCLK
create_bd_intf_pin -mode Master -vlnv xilinx.com:interface:axis_rtl:1.0 M_AXIS_RX_C0
create_bd_intf_pin -mode Slave -vlnv xilinx.com:interface:axis_rtl:1.0 S_AXIS_TX_C0
create_bd_intf_pin -mode Master -vlnv xilinx.com:interface:axis_rtl:1.0 M_AXIS_RX_C1
create_bd_intf_pin -mode Slave -vlnv xilinx.com:display_aurora64b66b:GT_Serial_Transceiver_Pins_RX_rtl:1.0 GT_SERIAL_RX_C1
create_bd_intf_pin -mode Master -vlnv xilinx.com:display_aurora64b66b:GT_Serial_Transceiver_Pins_TX_rtl:1.0 GT_SERIAL_TX_C1
create_bd_intf_pin -mode Master -vlnv xilinx.com:display_aurora64b66b:GT_Serial_Transceiver_Pins_TX_rtl:1.0 GT_SERIAL_TX_C0
create_bd_intf_pin -mode Slave -vlnv xilinx.com:display_aurora64b66b:GT_Serial_Transceiver_Pins_RX_rtl:1.0 GT_SERIAL_RX_C0
create_bd_intf_pin -mode Slave -vlnv xilinx.com:interface:axis_rtl:1.0 S_AXIS_TX_C1
create_bd_pin -dir O arstn_c1
create_bd_pin -dir O arstn_c0
create_bd_pin -dir I -type rst pma_init
create_bd_pin -dir O -type clk user_clk_out
create_bd_pin -dir I -type clk init_clk

create_bd_cell -type ip -vlnv xilinx.com:ip:aurora_64b66b:13.0 aurora_x1y8_0
set_property -dict [list \
  CONFIG.C_AURORA_LANES 2 \
  CONFIG.C_LINE_RATE 25.625 \
  CONFIG.C_REFCLK_SOURCE MGTREFCLK0_of_Quad_X1Y8 \
  CONFIG.C_START_LANE X1Y32 \
  CONFIG.C_START_QUAD Quad_X1Y8 \
  CONFIG.C_UCOLUMN_USED right \
  CONFIG.SupportLevel 1 \
  CONFIG.drp_mode Disabled \
  CONFIG.interface_mode Framing \
] [get_bd_cells aurora_x1y8_0]
create_bd_cell -type ip -vlnv xilinx.com:ip:vio:3.0 x1y8_core_status_1
set_property -dict {CONFIG.C_NUM_PROBE_IN 3 CONFIG.C_NUM_PROBE_OUT 0 CONFIG.C_PROBE_IN2_WIDTH 2} [get_bd_cells x1y8_core_status_1]
create_bd_cell -type ip -vlnv xilinx.com:ip:aurora_64b66b:13.0 aurora_x1y8_1
set_property -dict [list \
  CONFIG.C_AURORA_LANES 2 \
  CONFIG.C_LINE_RATE 25.625 \
  CONFIG.C_START_LANE X1Y34 \
  CONFIG.C_START_QUAD Quad_X1Y8 \
  CONFIG.C_UCOLUMN_USED right \
  CONFIG.SupportLevel 0 \
  CONFIG.drp_mode Disabled \
  CONFIG.interface_mode Framing \
] [get_bd_cells aurora_x1y8_1]
create_bd_cell -type ip -vlnv xilinx.com:ip:vio:3.0 x1y8_core_status_0
set_property -dict [list \
  CONFIG.C_NUM_PROBE_IN 3 \
  CONFIG.C_NUM_PROBE_OUT 0 \
  CONFIG.C_PROBE_IN2_WIDTH 2 \
  CONFIG.C_PROBE_IN5_WIDTH 2 \
] [get_bd_cells x1y8_core_status_0]
create_bd_cell -type module -reference auto_reset_aurora auto_reset_aurora
create_bd_cell -type module -reference aurora_rstn aurora_rstn_0
create_bd_cell -type module -reference aurora_rstn aurora_rstn_1

# ---- hierarchy /hier_x1y9 ----
current_bd_instance /hier_x1y9
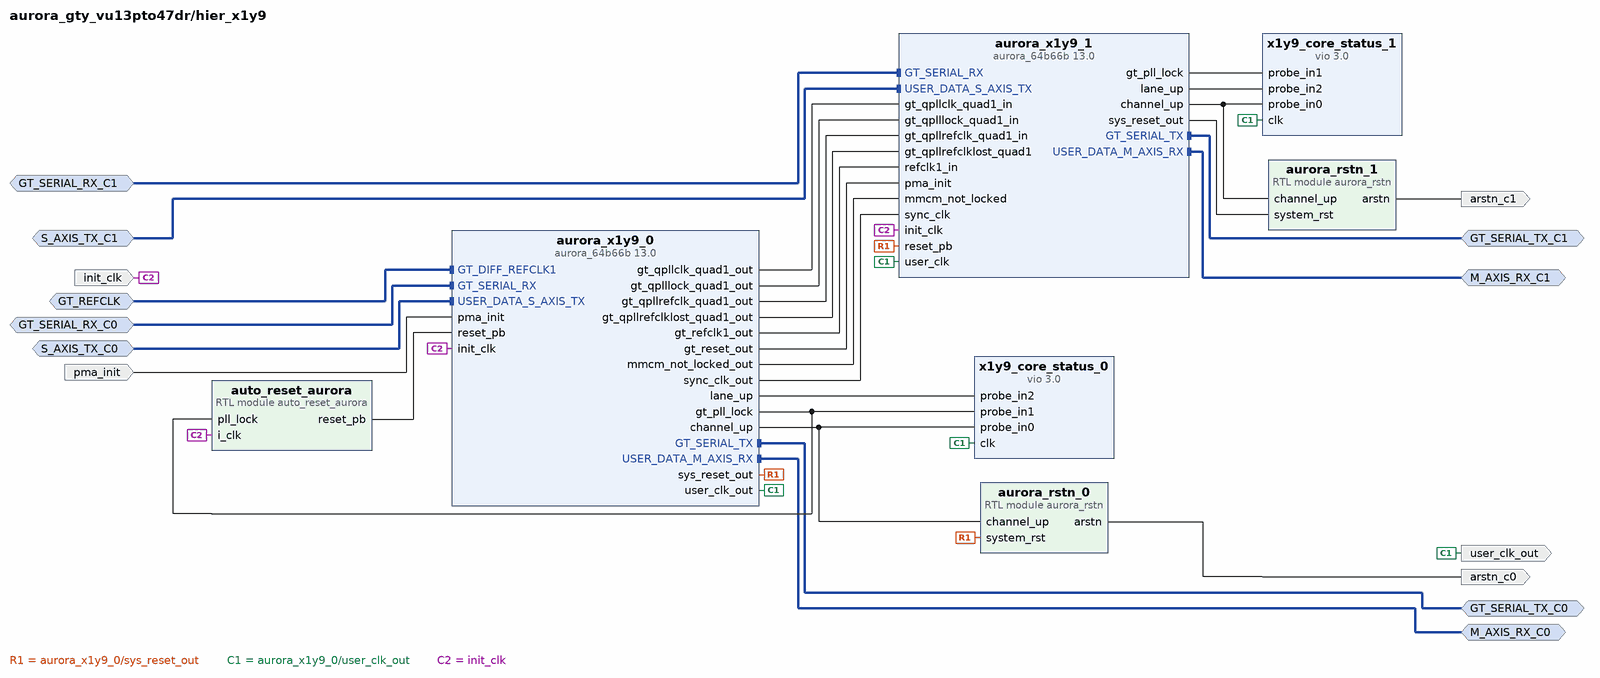
[diagram p3: block diagram inside /hier_x1y9]
create_bd_intf_pin -mode Slave -vlnv xilinx.com:interface:diff_clock_rtl:1.0 GT_REFCLK
create_bd_intf_pin -mode Master -vlnv xilinx.com:interface:axis_rtl:1.0 M_AXIS_RX_C0
create_bd_intf_pin -mode Slave -vlnv xilinx.com:interface:axis_rtl:1.0 S_AXIS_TX_C0
create_bd_intf_pin -mode Master -vlnv xilinx.com:interface:axis_rtl:1.0 M_AXIS_RX_C1
create_bd_intf_pin -mode Slave -vlnv xilinx.com:display_aurora64b66b:GT_Serial_Transceiver_Pins_RX_rtl:1.0 GT_SERIAL_RX_C1
create_bd_intf_pin -mode Master -vlnv xilinx.com:display_aurora64b66b:GT_Serial_Transceiver_Pins_TX_rtl:1.0 GT_SERIAL_TX_C1
create_bd_intf_pin -mode Master -vlnv xilinx.com:display_aurora64b66b:GT_Serial_Transceiver_Pins_TX_rtl:1.0 GT_SERIAL_TX_C0
create_bd_intf_pin -mode Slave -vlnv xilinx.com:display_aurora64b66b:GT_Serial_Transceiver_Pins_RX_rtl:1.0 GT_SERIAL_RX_C0
create_bd_intf_pin -mode Slave -vlnv xilinx.com:interface:axis_rtl:1.0 S_AXIS_TX_C1
create_bd_pin -dir O arstn_c1
create_bd_pin -dir O arstn_c0
create_bd_pin -dir I -type rst pma_init
create_bd_pin -dir O -type clk user_clk_out
create_bd_pin -dir I -type clk init_clk

create_bd_cell -type ip -vlnv xilinx.com:ip:aurora_64b66b:13.0 aurora_x1y9_0
set_property -dict [list \
  CONFIG.C_AURORA_LANES 2 \
  CONFIG.C_LINE_RATE 25.625 \
  CONFIG.C_REFCLK_SOURCE MGTREFCLK0_of_Quad_X1Y9 \
  CONFIG.C_START_LANE X1Y36 \
  CONFIG.C_START_QUAD Quad_X1Y9 \
  CONFIG.C_UCOLUMN_USED right \
  CONFIG.SupportLevel 1 \
  CONFIG.drp_mode Disabled \
  CONFIG.interface_mode Framing \
] [get_bd_cells aurora_x1y9_0]
create_bd_cell -type ip -vlnv xilinx.com:ip:vio:3.0 x1y9_core_status_1
set_property -dict {CONFIG.C_NUM_PROBE_IN 3 CONFIG.C_NUM_PROBE_OUT 0 CONFIG.C_PROBE_IN2_WIDTH 2} [get_bd_cells x1y9_core_status_1]
create_bd_cell -type ip -vlnv xilinx.com:ip:aurora_64b66b:13.0 aurora_x1y9_1
set_property -dict [list \
  CONFIG.C_AURORA_LANES 2 \
  CONFIG.C_LINE_RATE 25.625 \
  CONFIG.C_START_LANE X1Y38 \
  CONFIG.C_START_QUAD Quad_X1Y9 \
  CONFIG.C_UCOLUMN_USED right \
  CONFIG.SupportLevel 0 \
  CONFIG.drp_mode Disabled \
  CONFIG.interface_mode Framing \
] [get_bd_cells aurora_x1y9_1]
create_bd_cell -type ip -vlnv xilinx.com:ip:vio:3.0 x1y9_core_status_0
set_property -dict [list \
  CONFIG.C_NUM_PROBE_IN 3 \
  CONFIG.C_NUM_PROBE_OUT 0 \
  CONFIG.C_PROBE_IN2_WIDTH 2 \
  CONFIG.C_PROBE_IN5_WIDTH 2 \
] [get_bd_cells x1y9_core_status_0]
create_bd_cell -type module -reference auto_reset_aurora auto_reset_aurora
create_bd_cell -type module -reference aurora_rstn aurora_rstn_0
create_bd_cell -type module -reference aurora_rstn aurora_rstn_1

# ---- hierarchy /hier_x1y10 ----
current_bd_instance /hier_x1y10
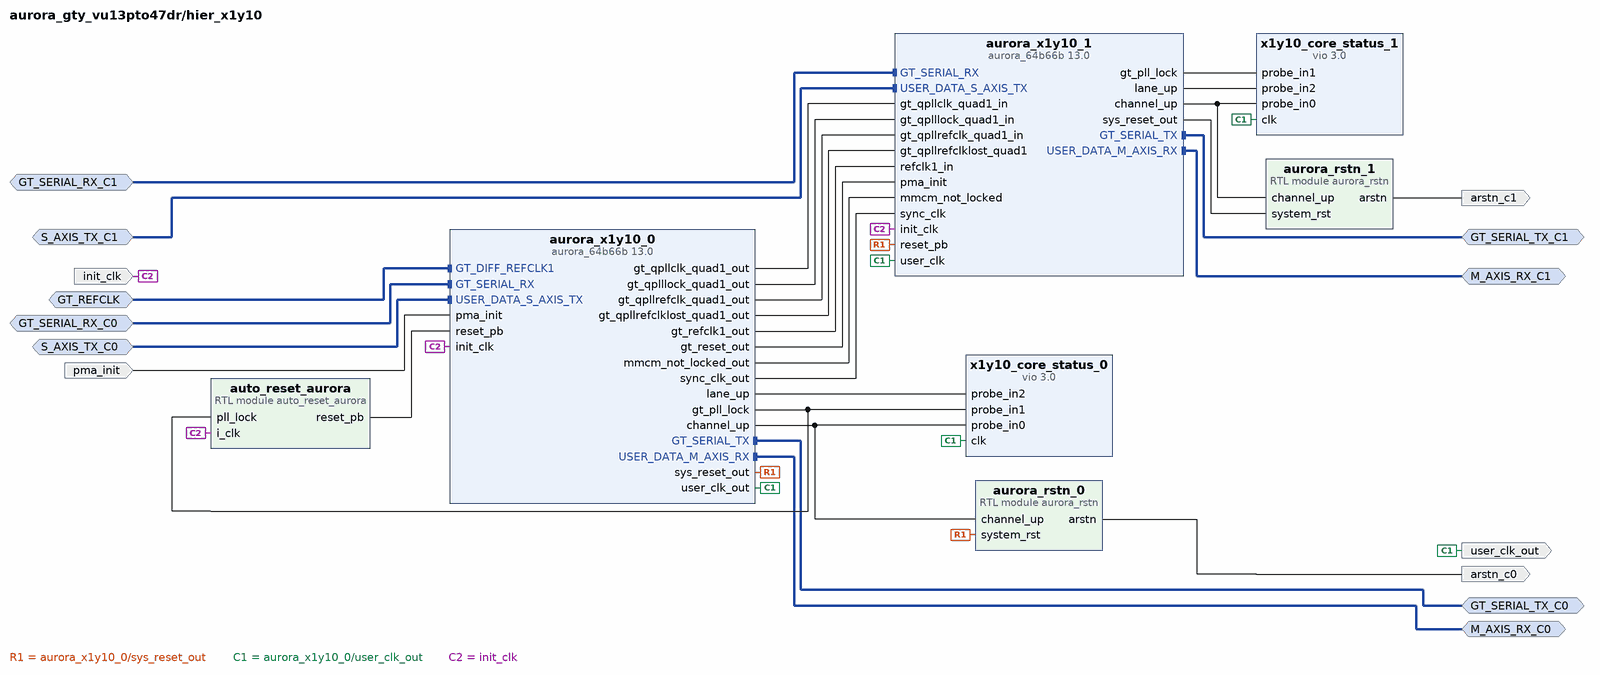
[diagram p4: block diagram inside /hier_x1y10]
create_bd_intf_pin -mode Slave -vlnv xilinx.com:interface:diff_clock_rtl:1.0 GT_REFCLK
create_bd_intf_pin -mode Master -vlnv xilinx.com:interface:axis_rtl:1.0 M_AXIS_RX_C0
create_bd_intf_pin -mode Slave -vlnv xilinx.com:interface:axis_rtl:1.0 S_AXIS_TX_C0
create_bd_intf_pin -mode Master -vlnv xilinx.com:interface:axis_rtl:1.0 M_AXIS_RX_C1
create_bd_intf_pin -mode Slave -vlnv xilinx.com:display_aurora64b66b:GT_Serial_Transceiver_Pins_RX_rtl:1.0 GT_SERIAL_RX_C1
create_bd_intf_pin -mode Master -vlnv xilinx.com:display_aurora64b66b:GT_Serial_Transceiver_Pins_TX_rtl:1.0 GT_SERIAL_TX_C1
create_bd_intf_pin -mode Master -vlnv xilinx.com:display_aurora64b66b:GT_Serial_Transceiver_Pins_TX_rtl:1.0 GT_SERIAL_TX_C0
create_bd_intf_pin -mode Slave -vlnv xilinx.com:display_aurora64b66b:GT_Serial_Transceiver_Pins_RX_rtl:1.0 GT_SERIAL_RX_C0
create_bd_intf_pin -mode Slave -vlnv xilinx.com:interface:axis_rtl:1.0 S_AXIS_TX_C1
create_bd_pin -dir O arstn_c1
create_bd_pin -dir O arstn_c0
create_bd_pin -dir I -type rst pma_init
create_bd_pin -dir O -type clk user_clk_out
create_bd_pin -dir I -type clk init_clk

create_bd_cell -type ip -vlnv xilinx.com:ip:aurora_64b66b:13.0 aurora_x1y10_0
set_property -dict [list \
  CONFIG.C_AURORA_LANES 2 \
  CONFIG.C_LINE_RATE 25.625 \
  CONFIG.C_REFCLK_SOURCE MGTREFCLK0_of_Quad_X1Y10 \
  CONFIG.C_START_LANE X1Y40 \
  CONFIG.C_START_QUAD Quad_X1Y10 \
  CONFIG.C_UCOLUMN_USED right \
  CONFIG.SupportLevel 1 \
  CONFIG.drp_mode Disabled \
  CONFIG.interface_mode Framing \
] [get_bd_cells aurora_x1y10_0]
create_bd_cell -type ip -vlnv xilinx.com:ip:vio:3.0 x1y10_core_status_1
set_property -dict [list \
  CONFIG.C_NUM_PROBE_IN 3 \
  CONFIG.C_NUM_PROBE_OUT 0 \
  CONFIG.C_PROBE_IN2_WIDTH 2 \
] [get_bd_cells x1y10_core_status_1]
create_bd_cell -type ip -vlnv xilinx.com:ip:aurora_64b66b:13.0 aurora_x1y10_1
set_property -dict [list \
  CONFIG.C_AURORA_LANES 2 \
  CONFIG.C_LINE_RATE 25.625 \
  CONFIG.C_START_LANE X1Y42 \
  CONFIG.C_START_QUAD Quad_X1Y10 \
  CONFIG.C_UCOLUMN_USED right \
  CONFIG.SupportLevel 0 \
  CONFIG.drp_mode Disabled \
  CONFIG.interface_mode Framing \
] [get_bd_cells aurora_x1y10_1]
create_bd_cell -type ip -vlnv xilinx.com:ip:vio:3.0 x1y10_core_status_0
set_property -dict [list \
  CONFIG.C_NUM_PROBE_IN 3 \
  CONFIG.C_NUM_PROBE_OUT 0 \
  CONFIG.C_PROBE_IN2_WIDTH 2 \
  CONFIG.C_PROBE_IN5_WIDTH 2 \
] [get_bd_cells x1y10_core_status_0]
create_bd_cell -type module -reference auto_reset_aurora auto_reset_aurora
create_bd_cell -type module -reference aurora_rstn aurora_rstn_0
create_bd_cell -type module -reference aurora_rstn aurora_rstn_1

# ---- hierarchy /hier_x1y11 ----
current_bd_instance /hier_x1y11
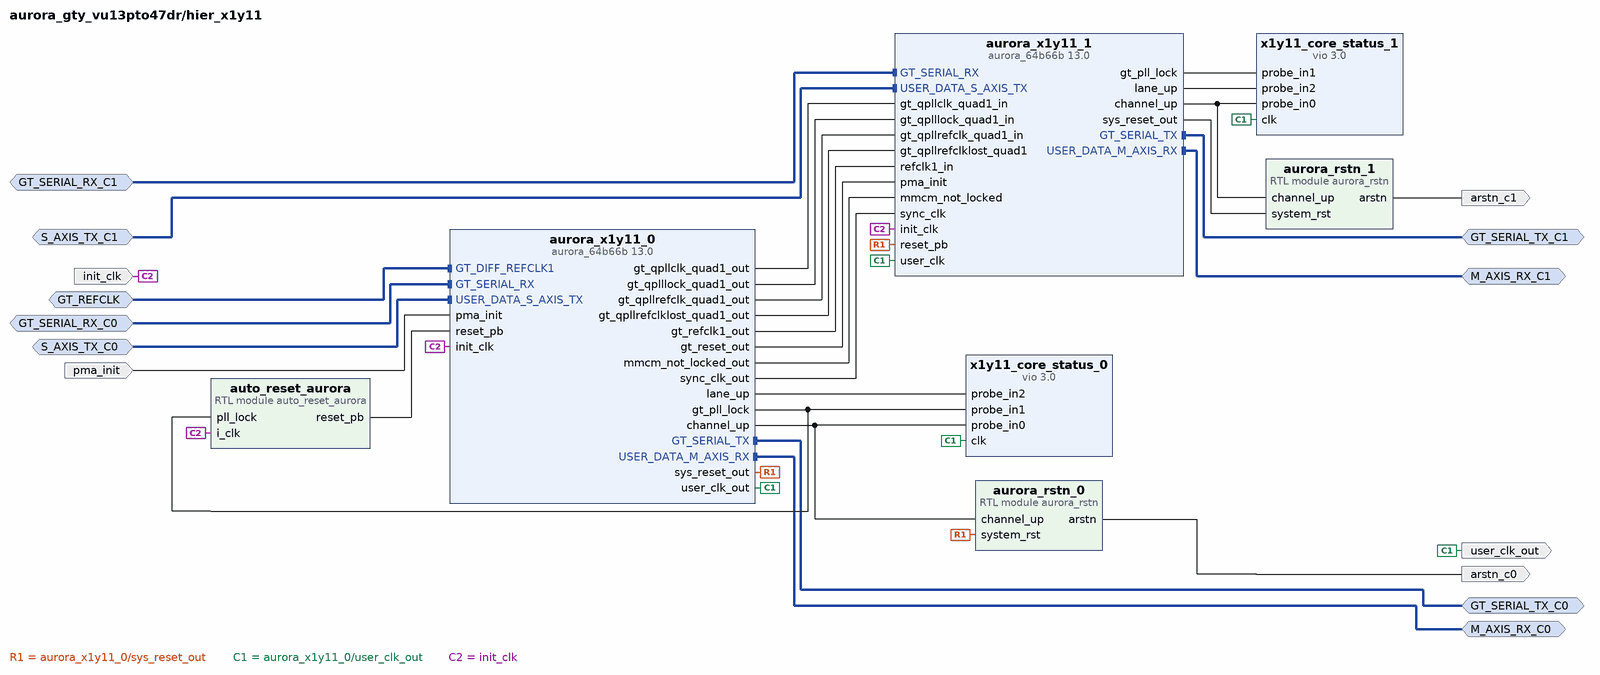
[diagram p5: block diagram inside /hier_x1y11]
create_bd_intf_pin -mode Slave -vlnv xilinx.com:interface:diff_clock_rtl:1.0 GT_REFCLK
create_bd_intf_pin -mode Master -vlnv xilinx.com:interface:axis_rtl:1.0 M_AXIS_RX_C0
create_bd_intf_pin -mode Slave -vlnv xilinx.com:interface:axis_rtl:1.0 S_AXIS_TX_C0
create_bd_intf_pin -mode Master -vlnv xilinx.com:interface:axis_rtl:1.0 M_AXIS_RX_C1
create_bd_intf_pin -mode Slave -vlnv xilinx.com:display_aurora64b66b:GT_Serial_Transceiver_Pins_RX_rtl:1.0 GT_SERIAL_RX_C1
create_bd_intf_pin -mode Master -vlnv xilinx.com:display_aurora64b66b:GT_Serial_Transceiver_Pins_TX_rtl:1.0 GT_SERIAL_TX_C1
create_bd_intf_pin -mode Master -vlnv xilinx.com:display_aurora64b66b:GT_Serial_Transceiver_Pins_TX_rtl:1.0 GT_SERIAL_TX_C0
create_bd_intf_pin -mode Slave -vlnv xilinx.com:display_aurora64b66b:GT_Serial_Transceiver_Pins_RX_rtl:1.0 GT_SERIAL_RX_C0
create_bd_intf_pin -mode Slave -vlnv xilinx.com:interface:axis_rtl:1.0 S_AXIS_TX_C1
create_bd_pin -dir O arstn_c1
create_bd_pin -dir O arstn_c0
create_bd_pin -dir I -type rst pma_init
create_bd_pin -dir O -type clk user_clk_out
create_bd_pin -dir I -type clk init_clk

create_bd_cell -type ip -vlnv xilinx.com:ip:aurora_64b66b:13.0 aurora_x1y11_0
set_property -dict [list \
  CONFIG.C_AURORA_LANES 2 \
  CONFIG.C_LINE_RATE 25.625 \
  CONFIG.C_REFCLK_SOURCE MGTREFCLK0_of_Quad_X1Y11 \
  CONFIG.C_START_LANE X1Y44 \
  CONFIG.C_START_QUAD Quad_X1Y11 \
  CONFIG.C_UCOLUMN_USED right \
  CONFIG.SupportLevel 1 \
  CONFIG.drp_mode Disabled \
  CONFIG.interface_mode Framing \
] [get_bd_cells aurora_x1y11_0]
create_bd_cell -type ip -vlnv xilinx.com:ip:vio:3.0 x1y11_core_status_1
set_property -dict [list \
  CONFIG.C_NUM_PROBE_IN 3 \
  CONFIG.C_NUM_PROBE_OUT 0 \
  CONFIG.C_PROBE_IN2_WIDTH 2 \
] [get_bd_cells x1y11_core_status_1]
create_bd_cell -type ip -vlnv xilinx.com:ip:aurora_64b66b:13.0 aurora_x1y11_1
set_property -dict [list \
  CONFIG.C_AURORA_LANES 2 \
  CONFIG.C_LINE_RATE 25.625 \
  CONFIG.C_START_LANE X1Y46 \
  CONFIG.C_START_QUAD Quad_X1Y11 \
  CONFIG.C_UCOLUMN_USED right \
  CONFIG.SupportLevel 0 \
  CONFIG.drp_mode Disabled \
  CONFIG.interface_mode Framing \
] [get_bd_cells aurora_x1y11_1]
create_bd_cell -type ip -vlnv xilinx.com:ip:vio:3.0 x1y11_core_status_0
set_property -dict [list \
  CONFIG.C_NUM_PROBE_IN 3 \
  CONFIG.C_NUM_PROBE_OUT 0 \
  CONFIG.C_PROBE_IN2_WIDTH 2 \
  CONFIG.C_PROBE_IN5_WIDTH 2 \
] [get_bd_cells x1y11_core_status_0]
create_bd_cell -type module -reference auto_reset_aurora auto_reset_aurora
create_bd_cell -type module -reference aurora_rstn aurora_rstn_0
create_bd_cell -type module -reference aurora_rstn aurora_rstn_1

# ---- hierarchy /hier_x1y5 ----
current_bd_instance /hier_x1y5
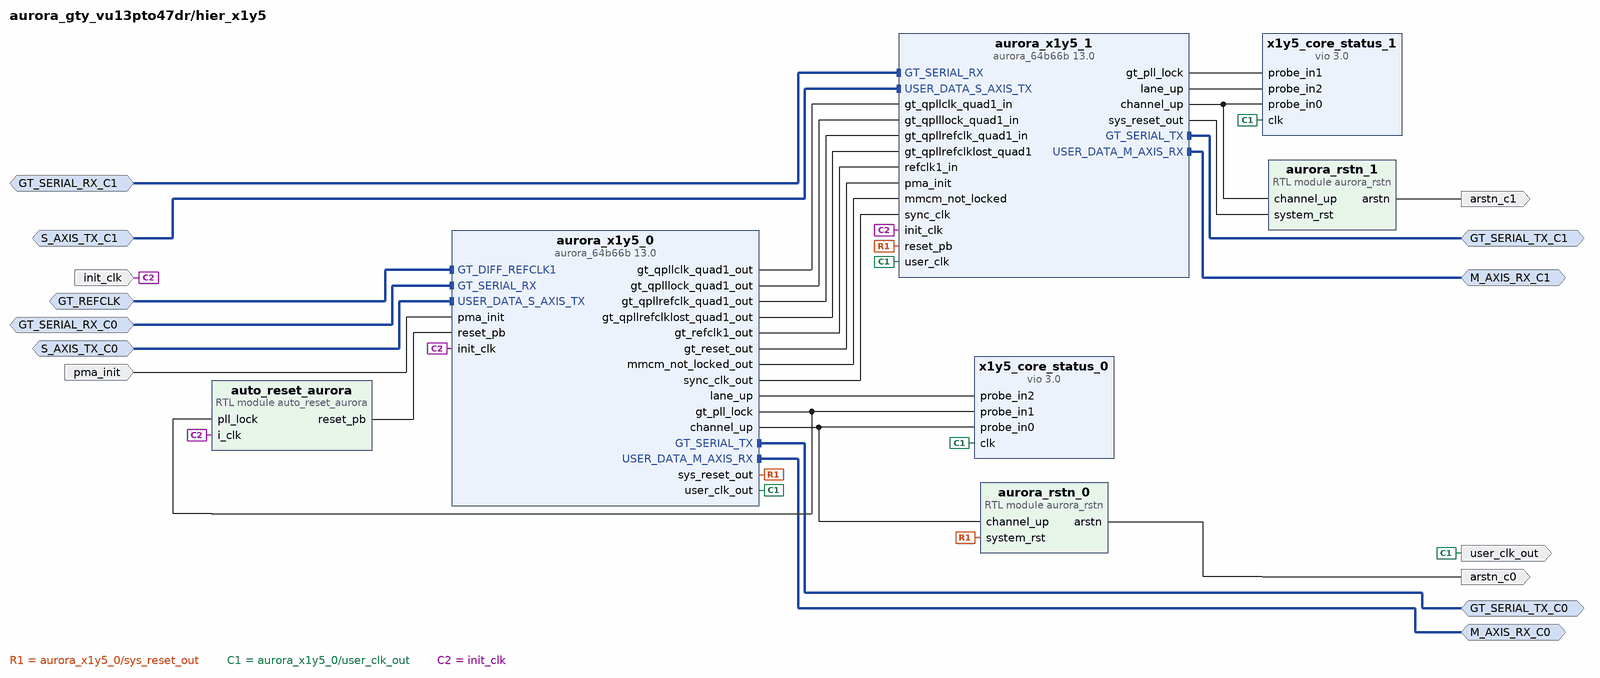
[diagram p6: block diagram inside /hier_x1y5]
create_bd_intf_pin -mode Slave -vlnv xilinx.com:interface:diff_clock_rtl:1.0 GT_REFCLK
create_bd_intf_pin -mode Master -vlnv xilinx.com:interface:axis_rtl:1.0 M_AXIS_RX_C0
create_bd_intf_pin -mode Slave -vlnv xilinx.com:interface:axis_rtl:1.0 S_AXIS_TX_C0
create_bd_intf_pin -mode Master -vlnv xilinx.com:interface:axis_rtl:1.0 M_AXIS_RX_C1
create_bd_intf_pin -mode Slave -vlnv xilinx.com:display_aurora64b66b:GT_Serial_Transceiver_Pins_RX_rtl:1.0 GT_SERIAL_RX_C1
create_bd_intf_pin -mode Master -vlnv xilinx.com:display_aurora64b66b:GT_Serial_Transceiver_Pins_TX_rtl:1.0 GT_SERIAL_TX_C1
create_bd_intf_pin -mode Master -vlnv xilinx.com:display_aurora64b66b:GT_Serial_Transceiver_Pins_TX_rtl:1.0 GT_SERIAL_TX_C0
create_bd_intf_pin -mode Slave -vlnv xilinx.com:display_aurora64b66b:GT_Serial_Transceiver_Pins_RX_rtl:1.0 GT_SERIAL_RX_C0
create_bd_intf_pin -mode Slave -vlnv xilinx.com:interface:axis_rtl:1.0 S_AXIS_TX_C1
create_bd_pin -dir O arstn_c1
create_bd_pin -dir O arstn_c0
create_bd_pin -dir I -type rst pma_init
create_bd_pin -dir O -type clk user_clk_out
create_bd_pin -dir I -type clk init_clk

create_bd_cell -type ip -vlnv xilinx.com:ip:aurora_64b66b:13.0 aurora_x1y5_0
set_property -dict [list \
  CONFIG.C_AURORA_LANES 2 \
  CONFIG.C_LINE_RATE 25.625 \
  CONFIG.C_REFCLK_SOURCE MGTREFCLK0_of_Quad_X1Y5 \
  CONFIG.C_START_LANE X1Y20 \
  CONFIG.C_START_QUAD Quad_X1Y5 \
  CONFIG.C_UCOLUMN_USED right \
  CONFIG.SupportLevel 1 \
  CONFIG.drp_mode Disabled \
  CONFIG.interface_mode Framing \
] [get_bd_cells aurora_x1y5_0]
create_bd_cell -type ip -vlnv xilinx.com:ip:vio:3.0 x1y5_core_status_1
set_property -dict {CONFIG.C_NUM_PROBE_IN 3 CONFIG.C_NUM_PROBE_OUT 0 CONFIG.C_PROBE_IN2_WIDTH 2} [get_bd_cells x1y5_core_status_1]
create_bd_cell -type ip -vlnv xilinx.com:ip:aurora_64b66b:13.0 aurora_x1y5_1
set_property -dict [list \
  CONFIG.C_AURORA_LANES 2 \
  CONFIG.C_LINE_RATE 25.625 \
  CONFIG.C_START_LANE X1Y22 \
  CONFIG.C_START_QUAD Quad_X1Y5 \
  CONFIG.C_UCOLUMN_USED right \
  CONFIG.SupportLevel 0 \
  CONFIG.drp_mode Disabled \
  CONFIG.interface_mode Framing \
] [get_bd_cells aurora_x1y5_1]
create_bd_cell -type ip -vlnv xilinx.com:ip:vio:3.0 x1y5_core_status_0
set_property -dict [list \
  CONFIG.C_NUM_PROBE_IN 3 \
  CONFIG.C_NUM_PROBE_OUT 0 \
  CONFIG.C_PROBE_IN2_WIDTH 2 \
  CONFIG.C_PROBE_IN5_WIDTH 2 \
] [get_bd_cells x1y5_core_status_0]
create_bd_cell -type module -reference auto_reset_aurora auto_reset_aurora
create_bd_cell -type module -reference aurora_rstn aurora_rstn_0
create_bd_cell -type module -reference aurora_rstn aurora_rstn_1

# ---- hierarchy /hier_x1y6 ----
current_bd_instance /hier_x1y6
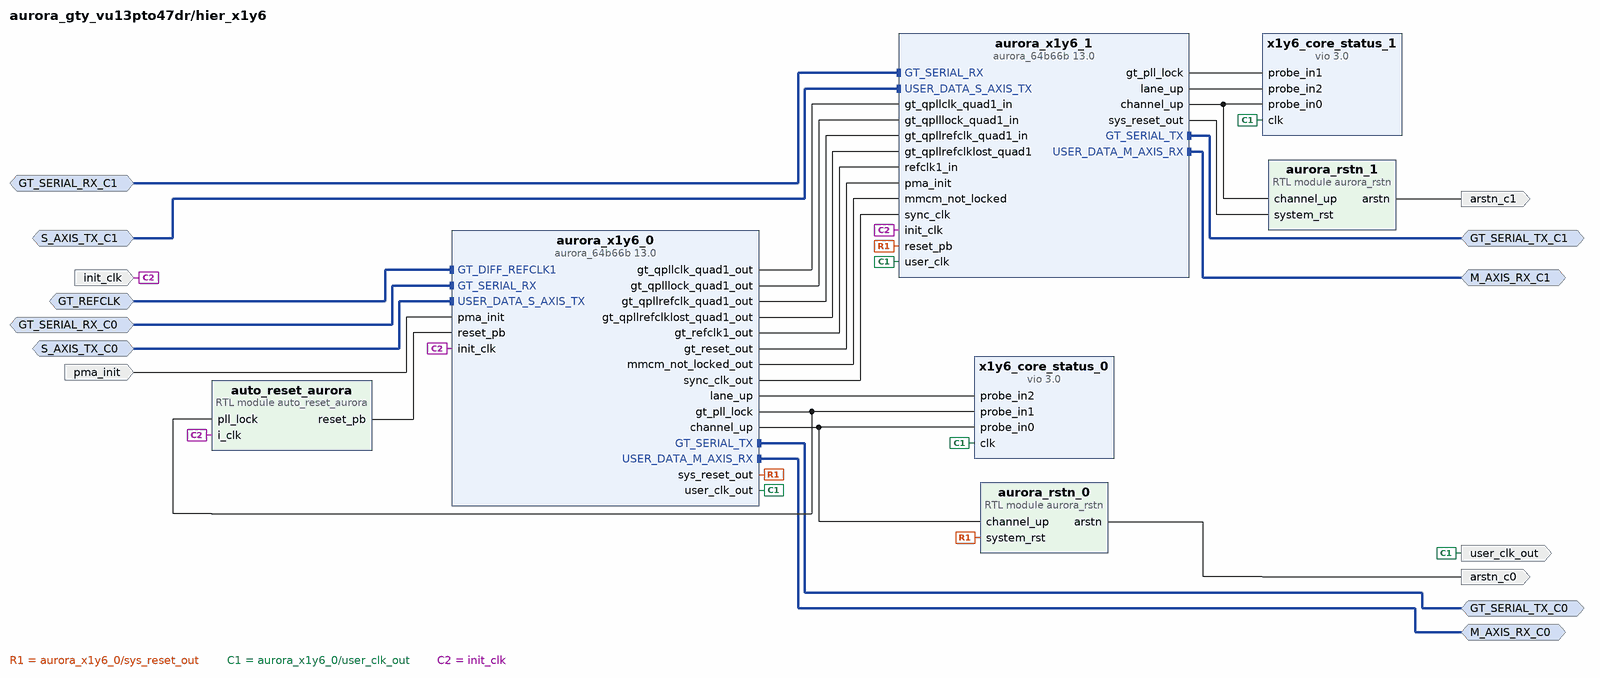
[diagram p7: block diagram inside /hier_x1y6]
create_bd_intf_pin -mode Slave -vlnv xilinx.com:interface:diff_clock_rtl:1.0 GT_REFCLK
create_bd_intf_pin -mode Master -vlnv xilinx.com:interface:axis_rtl:1.0 M_AXIS_RX_C0
create_bd_intf_pin -mode Slave -vlnv xilinx.com:interface:axis_rtl:1.0 S_AXIS_TX_C0
create_bd_intf_pin -mode Master -vlnv xilinx.com:interface:axis_rtl:1.0 M_AXIS_RX_C1
create_bd_intf_pin -mode Slave -vlnv xilinx.com:display_aurora64b66b:GT_Serial_Transceiver_Pins_RX_rtl:1.0 GT_SERIAL_RX_C1
create_bd_intf_pin -mode Master -vlnv xilinx.com:display_aurora64b66b:GT_Serial_Transceiver_Pins_TX_rtl:1.0 GT_SERIAL_TX_C1
create_bd_intf_pin -mode Master -vlnv xilinx.com:display_aurora64b66b:GT_Serial_Transceiver_Pins_TX_rtl:1.0 GT_SERIAL_TX_C0
create_bd_intf_pin -mode Slave -vlnv xilinx.com:display_aurora64b66b:GT_Serial_Transceiver_Pins_RX_rtl:1.0 GT_SERIAL_RX_C0
create_bd_intf_pin -mode Slave -vlnv xilinx.com:interface:axis_rtl:1.0 S_AXIS_TX_C1
create_bd_pin -dir O arstn_c1
create_bd_pin -dir O arstn_c0
create_bd_pin -dir I -type rst pma_init
create_bd_pin -dir O -type clk user_clk_out
create_bd_pin -dir I -type clk init_clk

create_bd_cell -type ip -vlnv xilinx.com:ip:aurora_64b66b:13.0 aurora_x1y6_0
set_property -dict [list \
  CONFIG.C_AURORA_LANES 2 \
  CONFIG.C_LINE_RATE 25.625 \
  CONFIG.C_REFCLK_SOURCE MGTREFCLK0_of_Quad_X1Y6 \
  CONFIG.C_START_LANE X1Y24 \
  CONFIG.C_START_QUAD Quad_X1Y6 \
  CONFIG.C_UCOLUMN_USED right \
  CONFIG.SupportLevel 1 \
  CONFIG.drp_mode Disabled \
  CONFIG.interface_mode Framing \
] [get_bd_cells aurora_x1y6_0]
create_bd_cell -type ip -vlnv xilinx.com:ip:vio:3.0 x1y6_core_status_1
set_property -dict {CONFIG.C_NUM_PROBE_IN 3 CONFIG.C_NUM_PROBE_OUT 0 CONFIG.C_PROBE_IN2_WIDTH 2} [get_bd_cells x1y6_core_status_1]
create_bd_cell -type ip -vlnv xilinx.com:ip:aurora_64b66b:13.0 aurora_x1y6_1
set_property -dict [list \
  CONFIG.C_AURORA_LANES 2 \
  CONFIG.C_LINE_RATE 25.625 \
  CONFIG.C_START_LANE X1Y26 \
  CONFIG.C_START_QUAD Quad_X1Y6 \
  CONFIG.C_UCOLUMN_USED right \
  CONFIG.SupportLevel 0 \
  CONFIG.drp_mode Disabled \
  CONFIG.interface_mode Framing \
] [get_bd_cells aurora_x1y6_1]
create_bd_cell -type ip -vlnv xilinx.com:ip:vio:3.0 x1y6_core_status_0
set_property -dict [list \
  CONFIG.C_NUM_PROBE_IN 3 \
  CONFIG.C_NUM_PROBE_OUT 0 \
  CONFIG.C_PROBE_IN2_WIDTH 2 \
  CONFIG.C_PROBE_IN5_WIDTH 2 \
] [get_bd_cells x1y6_core_status_0]
create_bd_cell -type module -reference auto_reset_aurora auto_reset_aurora
create_bd_cell -type module -reference aurora_rstn aurora_rstn_0
create_bd_cell -type module -reference aurora_rstn aurora_rstn_1

# ---- hierarchy /hier_x1y7 ----
current_bd_instance /hier_x1y7
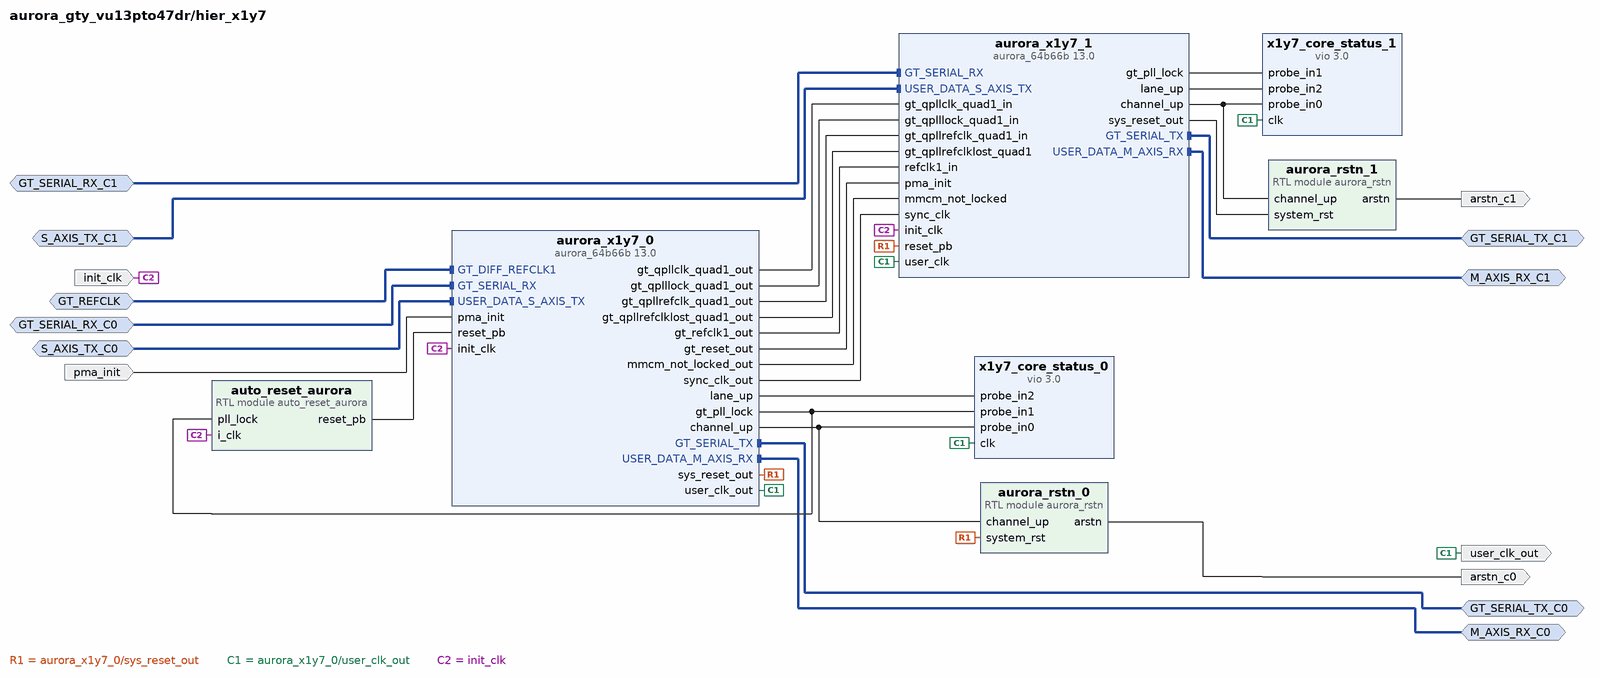
[diagram p8: block diagram inside /hier_x1y7]
create_bd_intf_pin -mode Slave -vlnv xilinx.com:interface:diff_clock_rtl:1.0 GT_REFCLK
create_bd_intf_pin -mode Master -vlnv xilinx.com:interface:axis_rtl:1.0 M_AXIS_RX_C0
create_bd_intf_pin -mode Slave -vlnv xilinx.com:interface:axis_rtl:1.0 S_AXIS_TX_C0
create_bd_intf_pin -mode Master -vlnv xilinx.com:interface:axis_rtl:1.0 M_AXIS_RX_C1
create_bd_intf_pin -mode Slave -vlnv xilinx.com:display_aurora64b66b:GT_Serial_Transceiver_Pins_RX_rtl:1.0 GT_SERIAL_RX_C1
create_bd_intf_pin -mode Master -vlnv xilinx.com:display_aurora64b66b:GT_Serial_Transceiver_Pins_TX_rtl:1.0 GT_SERIAL_TX_C1
create_bd_intf_pin -mode Master -vlnv xilinx.com:display_aurora64b66b:GT_Serial_Transceiver_Pins_TX_rtl:1.0 GT_SERIAL_TX_C0
create_bd_intf_pin -mode Slave -vlnv xilinx.com:display_aurora64b66b:GT_Serial_Transceiver_Pins_RX_rtl:1.0 GT_SERIAL_RX_C0
create_bd_intf_pin -mode Slave -vlnv xilinx.com:interface:axis_rtl:1.0 S_AXIS_TX_C1
create_bd_pin -dir O arstn_c1
create_bd_pin -dir O arstn_c0
create_bd_pin -dir I -type rst pma_init
create_bd_pin -dir O -type clk user_clk_out
create_bd_pin -dir I -type clk init_clk

create_bd_cell -type ip -vlnv xilinx.com:ip:aurora_64b66b:13.0 aurora_x1y7_0
set_property -dict [list \
  CONFIG.C_AURORA_LANES 2 \
  CONFIG.C_LINE_RATE 25.625 \
  CONFIG.C_REFCLK_SOURCE MGTREFCLK0_of_Quad_X1Y7 \
  CONFIG.C_START_LANE X1Y28 \
  CONFIG.C_START_QUAD Quad_X1Y7 \
  CONFIG.C_UCOLUMN_USED right \
  CONFIG.SupportLevel 1 \
  CONFIG.drp_mode Disabled \
  CONFIG.interface_mode Framing \
] [get_bd_cells aurora_x1y7_0]
create_bd_cell -type ip -vlnv xilinx.com:ip:vio:3.0 x1y7_core_status_1
set_property -dict {CONFIG.C_NUM_PROBE_IN 3 CONFIG.C_NUM_PROBE_OUT 0 CONFIG.C_PROBE_IN2_WIDTH 2} [get_bd_cells x1y7_core_status_1]
create_bd_cell -type ip -vlnv xilinx.com:ip:aurora_64b66b:13.0 aurora_x1y7_1
set_property -dict [list \
  CONFIG.C_AURORA_LANES 2 \
  CONFIG.C_LINE_RATE 25.625 \
  CONFIG.C_START_LANE X1Y30 \
  CONFIG.C_START_QUAD Quad_X1Y7 \
  CONFIG.C_UCOLUMN_USED right \
  CONFIG.SupportLevel 0 \
  CONFIG.drp_mode Disabled \
  CONFIG.interface_mode Framing \
] [get_bd_cells aurora_x1y7_1]
create_bd_cell -type ip -vlnv xilinx.com:ip:vio:3.0 x1y7_core_status_0
set_property -dict [list \
  CONFIG.C_NUM_PROBE_IN 3 \
  CONFIG.C_NUM_PROBE_OUT 0 \
  CONFIG.C_PROBE_IN2_WIDTH 2 \
  CONFIG.C_PROBE_IN5_WIDTH 2 \
] [get_bd_cells x1y7_core_status_0]
create_bd_cell -type module -reference auto_reset_aurora auto_reset_aurora
create_bd_cell -type module -reference aurora_rstn aurora_rstn_0
create_bd_cell -type module -reference aurora_rstn aurora_rstn_1

# ---- hierarchy /link_x1y4 ----
current_bd_instance /link_x1y4
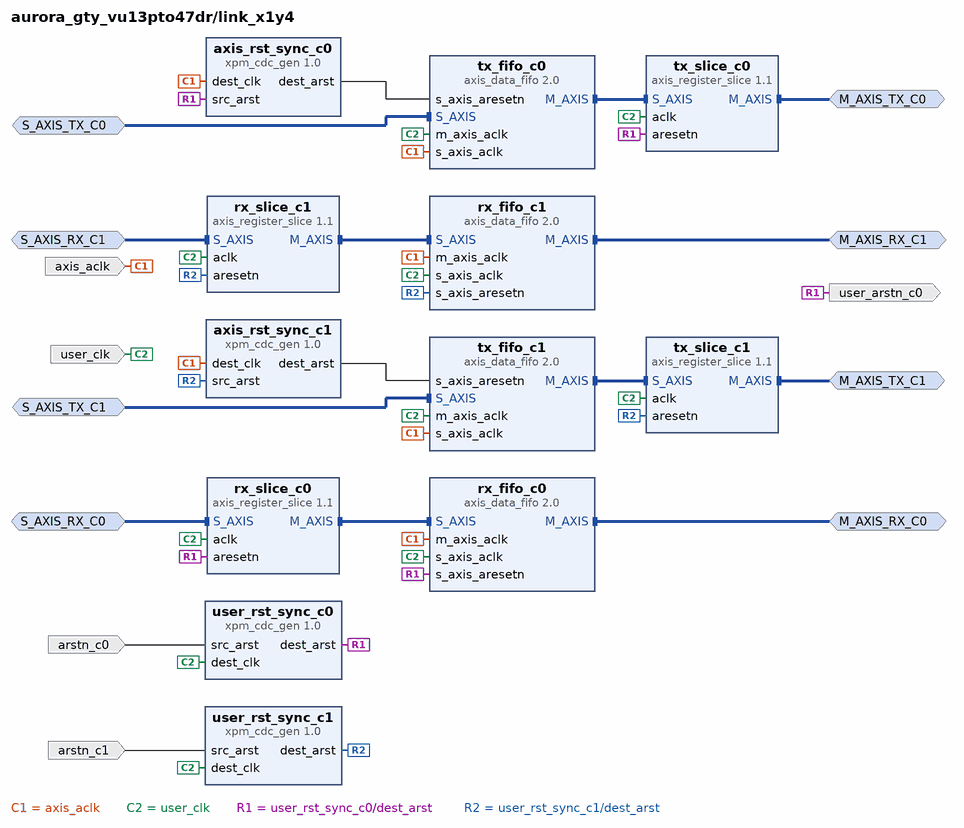
[diagram p9: block diagram inside /link_x1y4]
create_bd_intf_pin -mode Master -vlnv xilinx.com:interface:axis_rtl:1.0 M_AXIS_RX_C0
create_bd_intf_pin -mode Master -vlnv xilinx.com:interface:axis_rtl:1.0 M_AXIS_RX_C1
create_bd_intf_pin -mode Slave -vlnv xilinx.com:interface:axis_rtl:1.0 S_AXIS_TX_C0
create_bd_intf_pin -mode Slave -vlnv xilinx.com:interface:axis_rtl:1.0 S_AXIS_TX_C1
create_bd_intf_pin -mode Master -vlnv xilinx.com:interface:axis_rtl:1.0 M_AXIS_TX_C0
create_bd_intf_pin -mode Master -vlnv xilinx.com:interface:axis_rtl:1.0 M_AXIS_TX_C1
create_bd_intf_pin -mode Slave -vlnv xilinx.com:interface:axis_rtl:1.0 S_AXIS_RX_C0
create_bd_intf_pin -mode Slave -vlnv xilinx.com:interface:axis_rtl:1.0 S_AXIS_RX_C1
create_bd_pin -dir O user_arstn_c0
create_bd_pin -dir I -type clk user_clk
create_bd_pin -dir I -type clk axis_aclk
create_bd_pin -dir I arstn_c1
create_bd_pin -dir I arstn_c0
